# Altium project SAR.PrjPcb
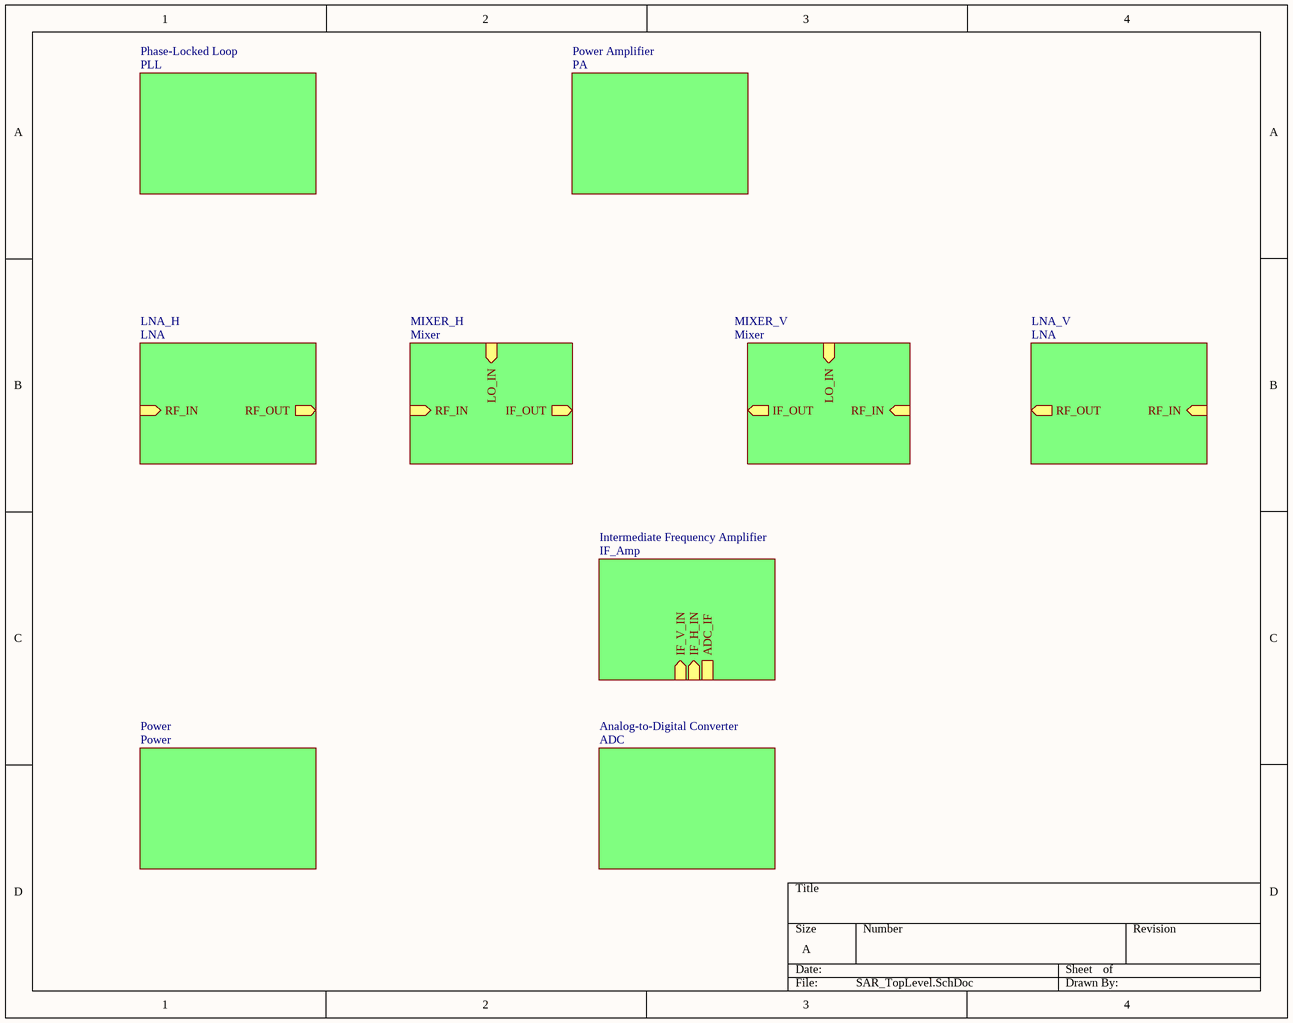
[diagram p0: SAR_TopLevel.SchDoc]
8 sheets, 169 parts. Net scope: hierarchical (ports join the sheet entries above them; power ports are global).
Board file: SAR.PcbDoc
Sheets:
  SAR_TopLevel.SchDoc
    LNA_V = LNA.SchDoc
    MIXER_V = Mixer.SchDoc
    Phase-Locked Loop = PLL.SchDoc
    Intermediate Frequency Amplifier = IF_Amp.SchDoc
    Power = Power.SchDoc
    MIXER_H = Mixer.SchDoc
    LNA_H = LNA.SchDoc
    Analog-to-Digital Converter = ADC.SchDoc
    Power Amplifier = PA.SchDoc

## Sheet SAR_TopLevel.SchDoc
size A; SheetNumber: 1; SheetTotal: 9

### Sub-sheets
Analog-to-Digital Converter = ADC: no entries
Intermediate Frequency Amplifier = IF_Amp: IF_V_IN (in), IF_H_IN (in), ADC_IF (harness ADC_IF)
LNA_H = LNA: RF_IN (in), RF_OUT (out)
LNA_V = LNA: RF_IN (in), RF_OUT (out)
MIXER_H = Mixer: RF_IN (in), IF_OUT (out), LO_IN (in)
MIXER_V = Mixer: LO_IN (in), RF_IN (in), IF_OUT (out)
Phase-Locked Loop = PLL: no entries
Power = Power: no entries
Power Amplifier = PA: no entries

## Sheet LNA.SchDoc
size A; SheetNumber: 4; SheetTotal: 9
Used 2 times, as channels LNA_V, LNA_H. Parts and nets are listed once, with the designators drawn on the sheet.
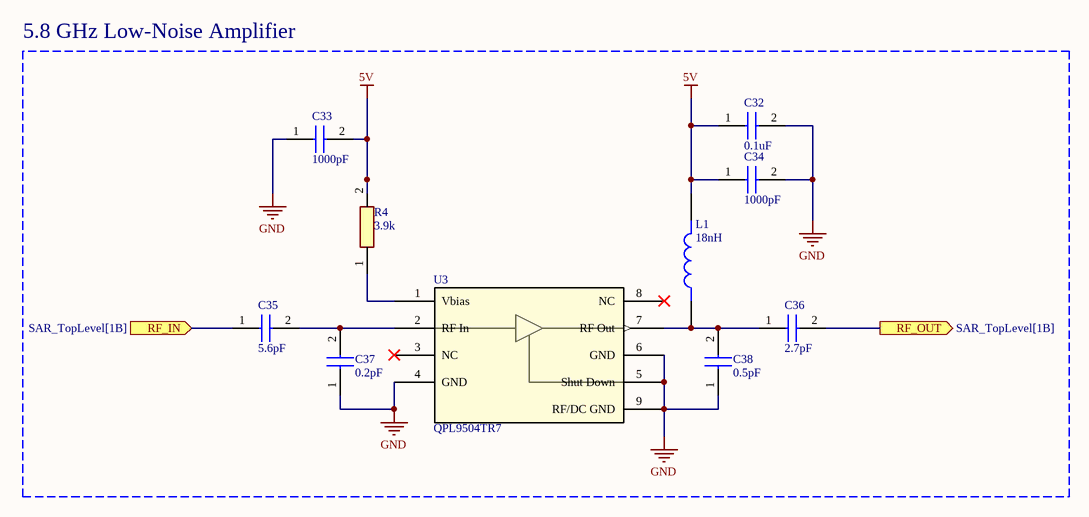
[diagram p1: LNA.SchDoc]

### Parts
C32  0.1uF  [CAPC1005X70N]
C33  1000pF  [CAPC1005X70N]
C34  1000pF  [CAPC1005X70N]
C35  5.6pF  [CAPC1005X55N]
C36  2.7pF  [CAPC1005X55N]
C37  0.2pF  [CAPC1005X55N]
C38  0.5pF  [CAPC1005X55N]
L1  18nH  [IND_0603CS-18NXJRW]
R4  3.9k  [RESC1005X40N]
U3  QPL9504TR7  [SON_504TR7_QOR]

### Blocks framed on the sheet
5.8 GHz Low-Noise Amplifier: C32-C38 L1 R4 U3

### Ports
RF_IN (in, see SAR_TopLevel[1B]), RF_OUT (out, see SAR_TopLevel[1B])

### Nets
5V: C32.1 C33.2 C34.1 L1.2 R4.2
GND: C32.2 C33.1 C34.2 C37.1 C38.1 U3.4(GND) U3.5(Shut_Down) U3.6(GND) U3.9(RF/DC_GND)
RF_IN: C35.1 ; port RF_IN
RF_OUT: C36.2 ; port RF_OUT
NetC35_2: C35.2 C37.2 U3.2(RF_In)
NetC36_1: C36.1 C38.2 L1.1 U3.7(RF_Out)
NetR4_1: R4.1 U3.1(Vbias)

Not connected (* = marked no-connect by the designer): U3 3(NC)* 8(NC)*

### Channels
LNA_V: designators end in _LNA_V; ports RF_IN=NetC35_LNA_V_1 RF_OUT=NetC36_LNA_V_2
LNA_H: designators end in _LNA_H; ports RF_IN=NetC35_LNA_H_1 RF_OUT=NetC36_LNA_H_2

### Library data of the parts
C32 = 0.1uF 0402 Capacitor: GRM155R61A104KA01D; Manufacturer_Name: Murata Electronics; Datasheet Link: https://search.murata.co.jp/Ceramy/image/img/A01X/G101/ENG/GRM155R61A104KA01-02A.pdf; Height: 0.7mm; Manufacturer_Part_Number: GRM155R61A104KA01D; Mouser Part Number: 81-GRM155R61A104KA01; Mouser Price/Stock: https://www.mouser.co.uk/ProductDetail/Murata-Electronics/GRM155R61A104KA01D?qs=5bAuhL3RhmNZw0v59AqOJA%3D%3D; Arrow Part Number: GRM155R61A104KA01D; Arrow Price/Stock: https://www.arrow.com/en/products/grm155r61a104ka01d/murata-manufacturing?utm_currency=USD&region=nac
C33 C34 = 1000pF 0402 Capacitor: GRM155R71H102KA01D; Manufacturer_Name: Murata Electronics; Datasheet Link: https://search.murata.co.jp/Ceramy/image/img/A01X/G101/ENG/GRM155R71H102KA01-01A.pdf; Height: 0.7mm; Manufacturer_Part_Number: GRM155R71H102KA01D; Mouser Part Number: 81-GRM36X102K50; Mouser Price/Stock: https://www.mouser.co.uk/ProductDetail/Murata-Electronics/GRM155R71H102KA01D?qs=%252B5p24MMGZE%2FUF%252ByMyO6GBQ%3D%3D; Arrow Part Number: GRM155R71H102KA01D; Arrow Price/Stock: https://www.arrow.com/en/products/grm155r71h102ka01d/murata-manufacturing?utm_currency=USD&region=nac
C35 = 5.6pF 0402 Capacitor: GJM1555C1H5R6CB01D; Manufacturer_Name: Murata Electronics; Datasheet Link: https://search.murata.co.jp/Ceramy/image/img/A01X/G101/ENG/GJM1555C1H5R6CB01-01A.pdf; Height: 0.55mm; Manufacturer_Part_Number: GJM1555C1H5R6CB01D; Mouser Part Number: 81-GJM1555C1H5R6CB01; Mouser Price/Stock: https://www.mouser.co.uk/ProductDetail/Murata-Electronics/GJM1555C1H5R6CB01D?qs=8NPnst0KC%2FrMobio5LeaaQ%3D%3D; Arrow Part Number: GJM1555C1H5R6CB01D; Arrow Price/Stock: https://www.arrow.com/en/products/gjm1555c1h5r6cb01d/murata-manufacturing?region=nac
C36 = 2.7pF 0402 Capacitor: GJM1555C1H2R7CB01D; Manufacturer_Name: Murata Electronics; Datasheet Link: https://search.murata.co.jp/Ceramy/image/img/A01X/G101/ENG/GJM1555C1H2R7CB01-01A.pdf; Height: 0.55mm; Manufacturer_Part_Number: GJM1555C1H2R7CB01D; Mouser Part Number: 81-GJM1555C1H2R7CB1D; Mouser Price/Stock: https://www.mouser.com/Search/ProductDetail.aspx?qs=%2fCESi%252brw7l%252bwXyZVZJ18SA%3d%3d; Arrow Part Number: GJM1555C1H2R7CB01D; Arrow Price/Stock: https://www.arrow.com/en/products/gjm1555c1h2r7cb01d/murata-manufacturing
C37 = 0.2pF 0402 Capacitor: GJM1555C1HR20BB01D; Manufacturer_Name: Murata Electronics; Datasheet Link: https://search.murata.co.jp/Ceramy/image/img/A01X/G101/ENG/GJM1555C1HR20BB01-01A.pdf; Height: 0.55mm; Manufacturer_Part_Number: GJM1555C1HR20BB01D
C38 = 0.5pF 0402 Capacitor: GJM1555C1HR50BB01D; Manufacturer_Name: Murata Electronics; Datasheet Link: https://search.murata.co.jp/Ceramy/image/img/A01X/G101/ENG/GJM1555C1HR50BB01-01A.pdf; Height: 0.55mm; Manufacturer_Part_Number: GJM1555C1HR50BB01D; Mouser Part Number: 81-GJM1555C1HR50BB01; Mouser Price/Stock: https://www.mouser.com/Search/Refine.aspx?Keyword=81-GJM1555C1HR50BB01; Arrow Part Number: GJM1555C1HR50BB01D; Arrow Price/Stock: https://www.arrow.com/en/products/gjm1555c1hr50bb01d/murata-manufacturing
L1 = 18nH 0603 Inductor: 0603CS-18NXJRW; Package: None; Price: None; Value: *; MP: 0603CS-18NXJRW; Availability: Unavailable
R4 = 3.9k 0402 Resistor: RC0402FR-073K9L; Manufacturer_Name: Yageo Group; Datasheet Link: http://www.yageo.com/documents/recent/PYu-RC0402_51_RoHS_L_6_r.pdf; Height: 0.4mm; Manufacturer_Part_Number: RC0402FR-073K9L; Mouser Part Number: 603-RC0402FR-073K9L; Mouser Price/Stock: https://www.mouser.co.uk/ProductDetail/Yageo/RC0402FR-073K9L?qs=YUgVZYePFqAZ%2F08ApUOsXg%3D%3D; Arrow Part Number: RC0402FR-073K9L; Arrow Price/Stock: https://www.arrow.com/en/products/rc0402fr-073k9l/yageo
U3 = QPL9504TR7: Description; Manufacturer_Name: Qorvo; Copyright: Copyright (C) 2026 Ultra Librarian. All rights reserved.; Manufacturer_Part_Number: QPL9504TR7; RefDes: RefDes; Type: Type

## Sheet Mixer.SchDoc
size B; SheetNumber: 3; SheetTotal: 9
Used 2 times, as channels MIXER_V, MIXER_H. Parts and nets are listed once, with the designators drawn on the sheet.
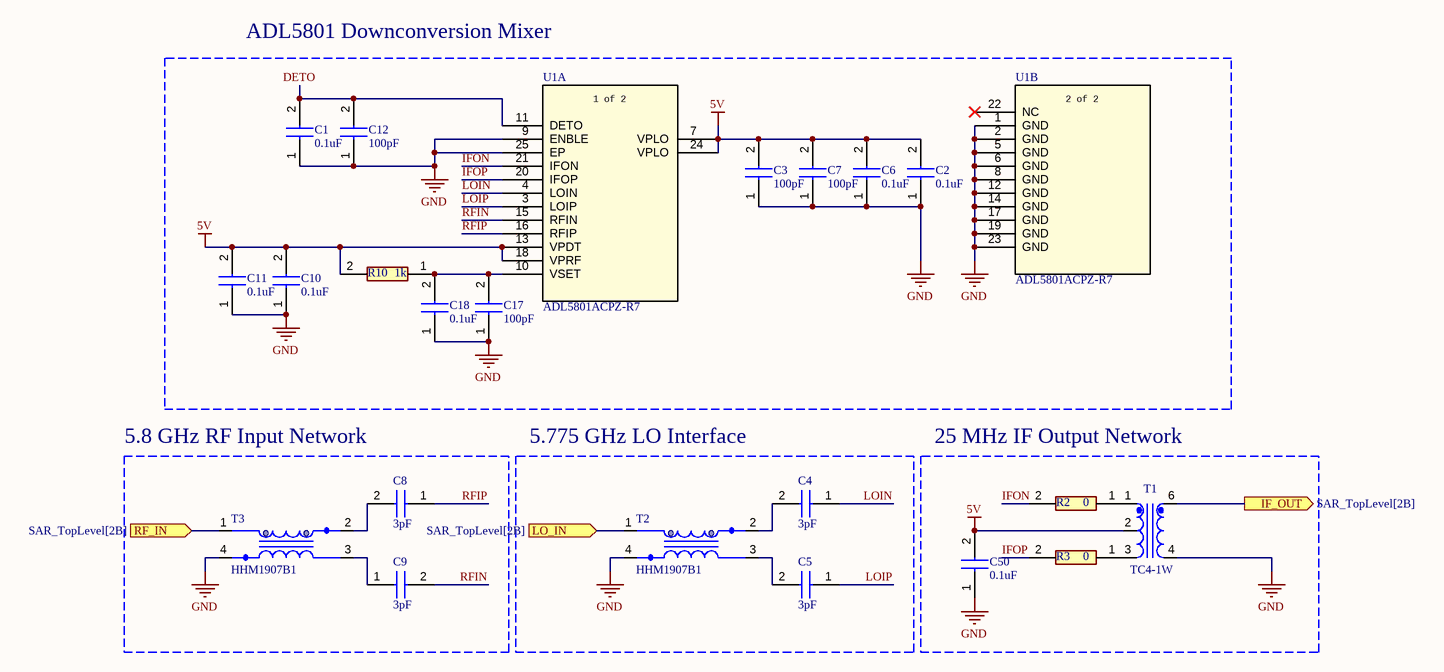
[diagram p2: Mixer.SchDoc]

### Parts
C1  0.1uF  [C0603]
C2  0.1uF  [C0402C104J4RACTU]
C3  100pF  [CAPC1005X70N]
C4  3pF  [CAPC1005X55N]
C5  3pF  [CAPC1005X55N]
C6  0.1uF  [C0402C104J4RACTU]
C7  100pF  [CAPC1005X70N]
C8  3pF  [CAPC1005X55N]
C9  3pF  [CAPC1005X55N]
C10  0.1uF  [C0402C104J4RACTU]
C11  0.1uF  [C0402C104J4RACTU]
C12  100pF  [CAPC1005X70N]
C17  100pF  [CAPC1005X70N]
C18  0.1uF  [C0603]
C50  0.1uF  [C0402C104J4RACTU]
R2  0  [RESC1005X40N]
R3  0  [RESC1005X40N]
R10  1k  [RESC1005X40N]
T1  TC4-1W  [AT224_MNC]
T2  HHM1907B1  [HHM1907B1]
T3  HHM1907B1  [HHM1907B1]
U1  ADL5801ACPZ-R7  [CP_24_3_ADI]  (parts A,B of 2)

### Blocks framed on the sheet
ADL5801 Downconversion Mixer: C1-C3 C6 C7 C10-C12 C17 C18 R10 U1
5.8 GHz RF Input Network: C8 C9 T3
5.775 GHz LO Interface: C4 C5 T2
25 MHz IF Output Network: C50 R2 R3 T1

### Ports
IF_OUT (out, see SAR_TopLevel[2B]), LO_IN (in, see SAR_TopLevel[2B]), RF_IN (in, see SAR_TopLevel[2B])

### Nets
5V: C2.2 C3.2 C6.2 C7.2 C10.2 C11.2 C50.2 R10.2 T1.2(PRICT) U1.7(VPLO) U1.13(VPDT) U1.18(VPRF) U1.24(VPLO)
GND: C1.1 C2.1 C3.1 C6.1 C7.1 C10.1 C11.1 C12.1 C17.1 C18.1 C50.1 T1.4(SEC) T2.4(GND) T3.4(GND) U1.1(GND) U1.2(GND) U1.5(GND) U1.6(GND) U1.8(GND) U1.9(ENBLE) U1.12(GND) U1.14(GND) U1.17(GND) U1.19(GND) U1.23(GND) U1.25(EP)
DETO: C1.2 C12.2 U1.11(DETO)
IF_OUT: T1.6(SECDOT) ; port IF_OUT
IFON: R2.2 U1.21(IFON)
IFOP: R3.2 U1.20(IFOP)
LO_IN: T2.1(UNBAL) ; port LO_IN
LOIN: C4.1 U1.4(LOIN)
LOIP: C5.1 U1.3(LOIP)
RF_IN: T3.1(UNBAL) ; port RF_IN
RFIN: C9.2 U1.15(RFIN)
RFIP: C8.1 U1.16(RFIP)
NetC4_2: C4.2 T2.2(BALANCED_1)
NetC5_2: C5.2 T2.3(BALANCED_2)
NetC8_2: C8.2 T3.2(BALANCED_1)
NetC9_1: C9.1 T3.3(BALANCED_2)
NetC17_2: C17.2 C18.2 R10.1 U1.10(VSET)
NetR2_1: R2.1 T1.1(PRIDOT)
NetR3_1: R3.1 T1.3(PRI)

Not connected (* = marked no-connect by the designer): U1 22(NC)*

### Channels
MIXER_V: designators end in _MIXER_V; ports IF_OUT=NetT1_MIXER_V_6 LO_IN=NetT2_MIXER_V_1 RF_IN=NetT3_MIXER_V_1
MIXER_H: designators end in _MIXER_H; ports IF_OUT=NetT1_MIXER_H_6 LO_IN=NetT2_MIXER_H_1 RF_IN=NetT3_MIXER_H_1

### Notes on the sheet
- DWG. NO.
- REV.
- SHT.
- THIS DOCUMENT AND THE DATA DISCLOSED HEREIN OR HEREWITH IS THE PROPERTY OF ALTIUM LIMITED AND MAY BE FREELY DISTRIBUTED IN WHOLE. NO RIGHTS ARE RESERVED OR EXPRESS OR IMPLIED WARANTEE GIVEN.
- REVISION
- DESCRIPTION
- DATE
- APPROVED
- ENG:
- APPROVALS
- PROJECT
- DSN:
- CHK:
- REFERENCE DOCUMENTS
- PROJECT REVISION:
- TITLE
- DOCUMENT REVISION:
- DESIGN ITEM:
- BOM:
- FAB DWG:
- PCB DWG:
- ASSY DWG:
- SCALE:
- SIZE
- B
- CAGE CODE
- FILE NAME
- DWG NO.
- SHEET
- OF
- REV
- (in symbol ADL5801ACPZ-R7, part A) 1 of 2
- (in symbol ADL5801ACPZ-R7, part B) 2 of 2

### Library data of the parts
C1 C18 = 0.1uF 0603 Capacitor: C0603C104K4RACAUTO; Manufacturer_Name: Yageo Group; Datasheet Link: https://content.kemet.com/datasheets/KEM_C1023_X7R_AUTO_SMD.pdf; Height: 0.87mm; Manufacturer_Part_Number: C0603C104K4RACAUTO; Mouser Part Number: 80-C0603C104K4RAUTO; Mouser Price/Stock: https://www.mouser.co.uk/ProductDetail/KEMET/C0603C104K4RACAUTO?qs=OHu5RF0w3Qq6uXbO9XN%2FyA%3D%3D; Arrow Part Number: C0603C104K4RACAUTO; Arrow Price/Stock: https://www.arrow.com/en/products/c0603c104k4racauto/kemet-corporation?region=nac
C2 C6 C10 C11 = 0.1uF Capacitor 0402: C0402C104K4RACTU; Manufacturer_Name: Yageo Group; Datasheet Link: https://content.kemet.com/datasheets/KEM_C1002_X7R_SMD.pdf; Height: 0.55mm; Manufacturer_Part_Number: C0402C104K4RACTU; Mouser Part Number: 80-C0402C104K4R; Mouser Price/Stock: https://www.mouser.co.uk/ProductDetail/KEMET/C0402C104K4RACTU?qs=DBJr%252BvBUjU54jK7d4uAeew%3D%3D; Arrow Part Number: C0402C104K4RACTU; Arrow Price/Stock: https://www.arrow.com/en/products/c0402c104k4ractu/kemet-corporation.html?utm_currency=USD&region=nac
C3 C7 C12 C17 = 100pF Capacitor 0402: GRM1555C1H101JA01J; Manufacturer_Name: Murata Electronics; Datasheet Link: https://search.murata.co.jp/Ceramy/image/img/A01X/G101/ENG/GRM1555C1H101JA01-01A.pdf; Height: 0.7mm; Manufacturer_Part_Number: GRM1555C1H101JA01J; Mouser Part Number: 81-GRM1555C1H101JA1J; Mouser Price/Stock: https://www.mouser.co.uk/ProductDetail/Murata-Electronics/GRM1555C1H101JA01J?qs=ouTquLLW2S6yVyqkMCWoRg%3D%3D; Arrow Part Number: GRM1555C1H101JA01J; Arrow Price/Stock: https://www.arrow.com/en/products/grm1555c1h101ja01j/murata-manufacturing?utm_currency=USD&region=nac
C4 C5 C8 C9 = 3pF 0402 Capacitor: GJM1555C1H3R0BB01D; Manufacturer_Name: Murata Electronics; Datasheet Link: https://search.murata.co.jp/Ceramy/image/img/A01X/G101/ENG/GJM1555C1H3R0BB01-01A.pdf; Height: 0.55mm; Manufacturer_Part_Number: GJM1555C1H3R0BB01D; Mouser Part Number: 81-GJM1555C1H3R0BB01; Mouser Price/Stock: https://www.mouser.co.uk/ProductDetail/Murata-Electronics/GJM1555C1H3R0BB01D?qs=fOe5G3t%252BQHoZjxUrLCJNQQ%3D%3D; Arrow Part Number: GJM1555C1H3R0BB01D; Arrow Price/Stock: https://www.arrow.com/en/products/gjm1555c1h3r0bb01d/murata-manufacturing
C50 = 0.1uF 0402 Capacitor: C0402C104K4RACTU; Manufacturer_Name: Yageo Group; Datasheet Link: https://content.kemet.com/datasheets/KEM_C1002_X7R_SMD.pdf; Height: 0.55mm; Manufacturer_Part_Number: C0402C104K4RACTU; Mouser Part Number: 80-C0402C104K4R; Mouser Price/Stock: https://www.mouser.co.uk/ProductDetail/KEMET/C0402C104K4RACTU?qs=DBJr%252BvBUjU54jK7d4uAeew%3D%3D; Arrow Part Number: C0402C104K4RACTU; Arrow Price/Stock: https://www.arrow.com/en/products/c0402c104k4ractu/kemet-corporation.html?utm_currency=USD&region=nac
R2 R3 = 0 Ohm 0402 Resistor: RC0402JR-070RL; Manufacturer_Name: Yageo Group; Datasheet Link: https://www.yageo.com/upload/media/product/products/datasheet/rchip/PYu-RC_Group_51_RoHS_L_12.pdf; Height: 0.4mm; Manufacturer_Part_Number: RC0402JR-070RL; Mouser Part Number: 603-RC0402JR-070RL; Mouser Price/Stock: https://www.mouser.co.uk/ProductDetail/YAGEO/RC0402JR-070RL?qs=5Bml4Cp94iv7ykKkzPrwpQ%3D%3D; Arrow Part Number: RC0402JR-070RL; Arrow Price/Stock: https://www.arrow.com/en/products/rc0402jr-070rl/yageo.html?utm_currency=USD&region=asia
R10 = 1k 0402 Resistor: RC0402FR-071KL; Manufacturer_Name: Yageo Group; Datasheet Link: https://yageogroup.com/products/Resistors/part/RC0402FR-071KL; Height: 0.4mm; Manufacturer_Part_Number: RC0402FR-071KL; Mouser Part Number: 603-RC0402FR-071KL; Mouser Price/Stock: https://www.mouser.co.uk/ProductDetail/YAGEO/RC0402FR-071KL?qs=V1yeUXFNrknDEmWLmm5v6g%3D%3D; Arrow Part Number: RC0402FR-071KL; Arrow Price/Stock: https://www.arrow.com/en/products/rc0402fr-071kl/yageo.html?utm_currency=USD&region=asia
T1 = TC4-1W+ 1:4 Transformer: TC4-1W+; Manufacturer_Name: Mini Circuits; Copyright: Copyright (C) 2026 Ultra Librarian. All rights reserved.; Manufacturer_Part_Number: TC4-1W; RefDes: RefDes; Type: Type
T2 T3 = 5.8 GHz Balun Transformer: MANF: Mini-Circuit; PARAM: 10~6000MHz; DESC: DESCRIPTION; MANF_P#: TCM1-63AX+; PARAM2: 0.2W, 30mA, -40~85oC; ASSEMBLY: ASSEMBLY; PRICE: PRICE; VALUE: HHM1907B1
U1 = ADL5801ACPZ-R7: High IP3, 10 MHz TO 6 GHz, Active Mixer; Manufacturer_Name: Analog Devices Inc; Copyright: Copyright (C) 2026 Ultra Librarian. All rights reserved.; Manufacturer_Part_Number: ADL5801ACPZ-R7; Datasheet: https://www.analog.com/media/en/technical-documentation/data-sheets/ADL5801.pdf; RefDes: RefDes; Type: Type

## Sheet PLL.SchDoc
size B; SheetNumber: 6; SheetTotal: 8
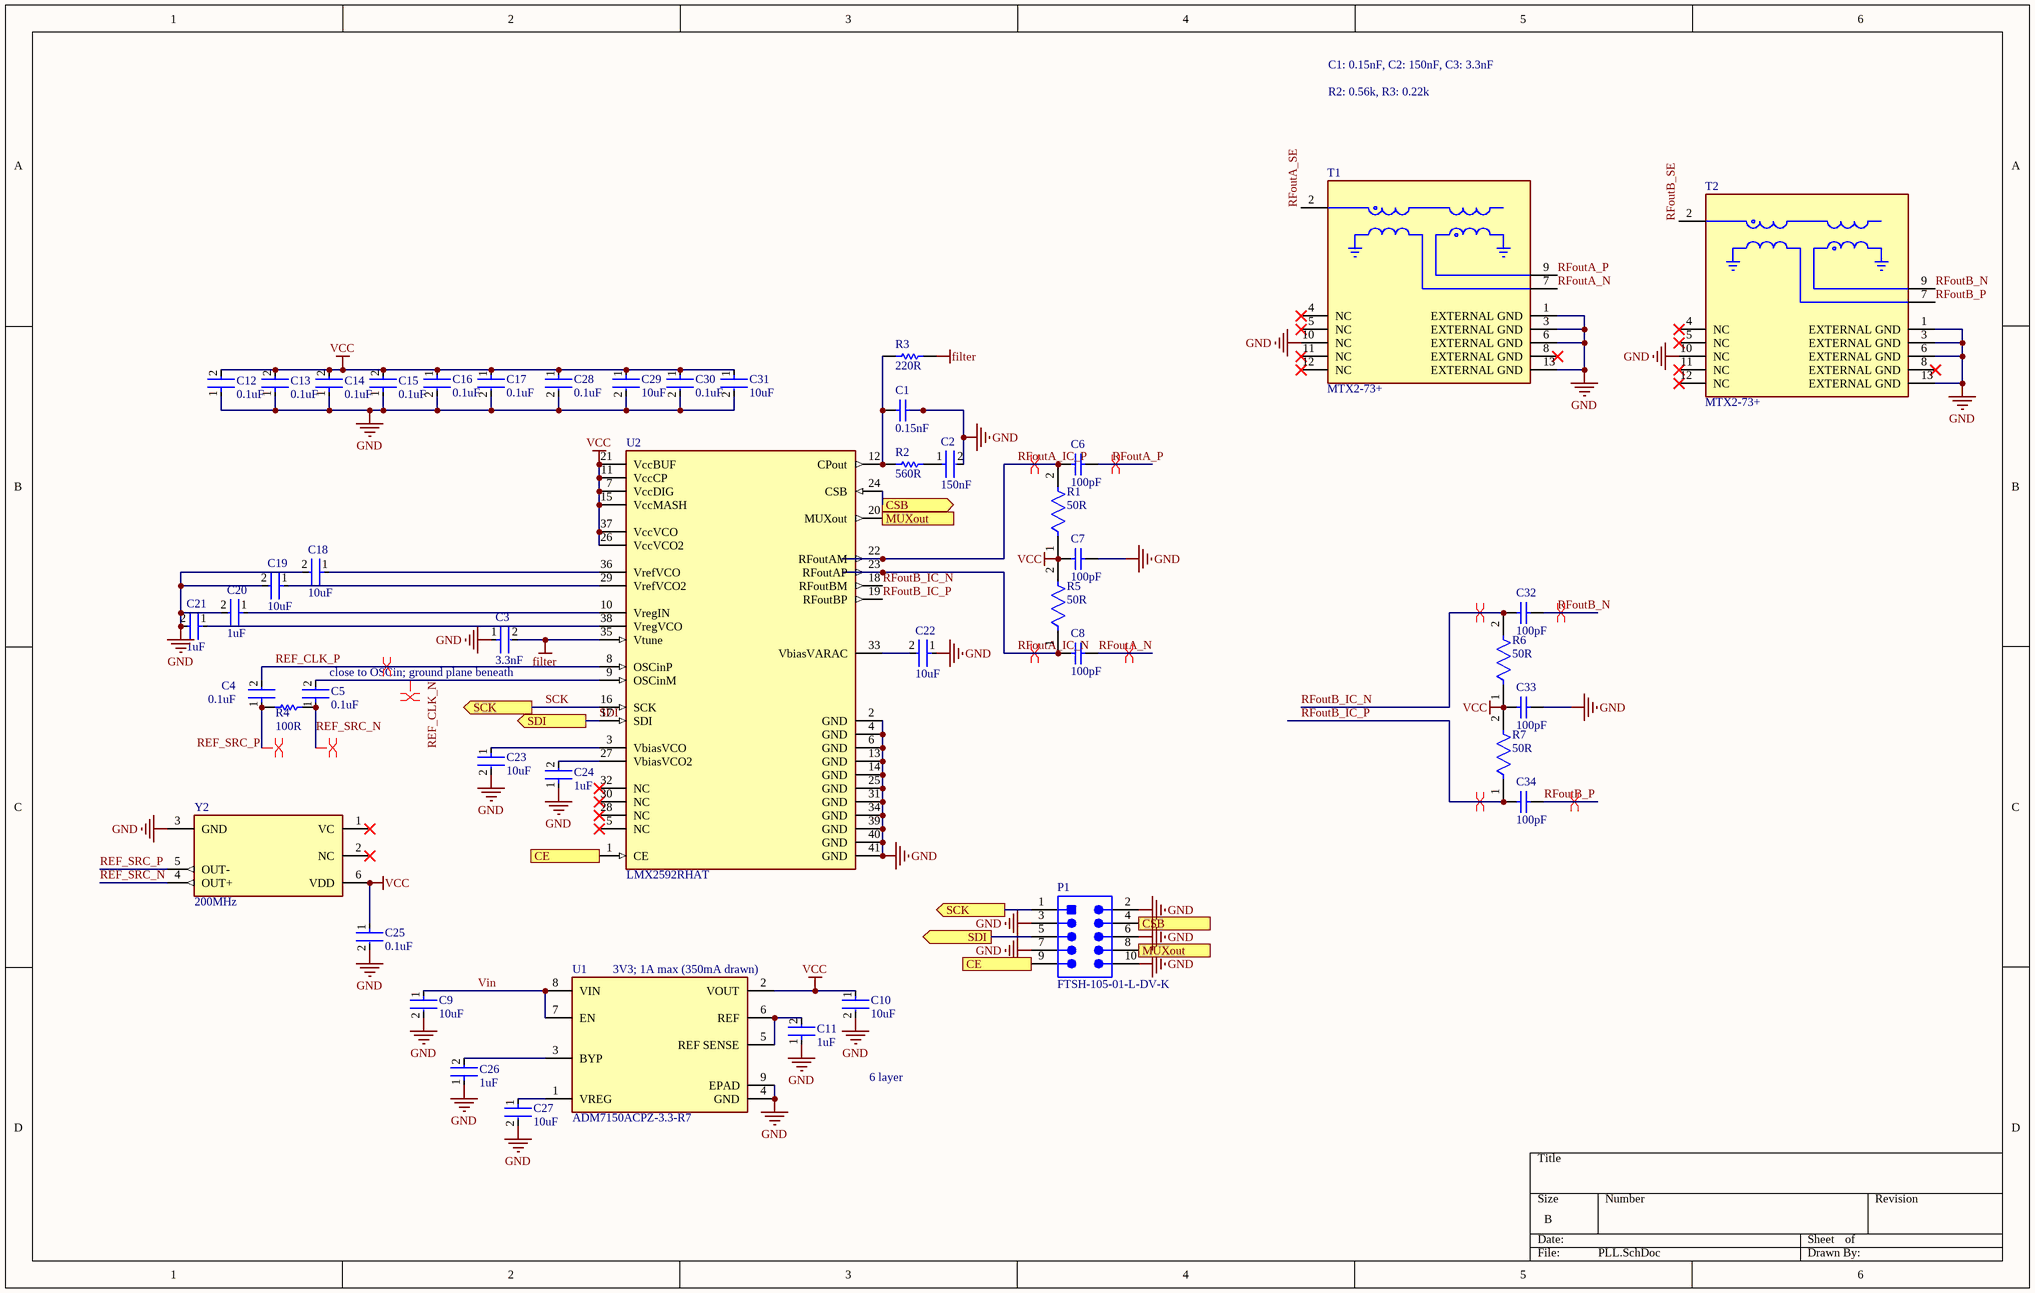
[diagram p3: PLL.SchDoc]

### Parts
(Parts that share a designator on the sheet are numbered #1, #2 ... from top to bottom, then left to right.)
C1#1  0.15nF  [CAPC1608X90X35LL15T15]
C2#1  150nF  [FP-GRM31C-0_2-e0_3_0_8-IPC_A]
C3#1  3.3nF  [FP-GCM188-0_1-MFG]
C4#1  0.1uF  [FP-C0603C-CF-MFG]
C5#1  0.1uF  [FP-C0603C-CF-MFG]
C6#1  100pF  [CAPC1608X90X35NL10T15]
C7#1  100pF  [CAPC1608X90X35NL10T15]
C8  100pF  [CAPC1608X90X35NL10T15]
C9  10uF  [FP-GRM188-0_15-MFG]
C10  10uF  [FP-GRM188-0_15-MFG]
C11  1uF  [FP-0603-L_1_6_0_15-W_0_8-IPC_C]
C12  0.1uF  [FP-C0603C-CF-MFG]
C13  0.1uF  [FP-C0603C-CF-MFG]
C14  0.1uF  [FP-C0603C-CF-MFG]
C15  0.1uF  [FP-C0603C-CF-MFG]
C16  0.1uF  [FP-C0603C-CF-MFG]
C17  0.1uF  [FP-C0603C-CF-MFG]
C18  10uF  [FP-GRM188-0_15-MFG]
C19  10uF  [FP-GRM188-0_15-MFG]
C20  1uF  [FP-0603-L_1_6_0_15-W_0_8-IPC_C]
C21  1uF  [FP-0603-L_1_6_0_15-W_0_8-IPC_C]
C22  10uF  [FP-GRM188-0_15-MFG]
C23  10uF  [FP-GRM188-0_15-MFG]
C24  1uF  [FP-0603-L_1_6_0_15-W_0_8-IPC_C]
C25  0.1uF  [FP-C0603C-CF-MFG]
C26  1uF  [FP-0603-L_1_6_0_15-W_0_8-IPC_C]
C27  10uF  [FP-GRM188-0_15-MFG]
C28  0.1uF  [FP-C0603C-CF-MFG]
C29  10uF  [FP-GRM188-0_15-MFG]
C30  0.1uF  [FP-C0603C-CF-MFG]
C31  10uF  [FP-GRM188-0_15-MFG]
C32  100pF  [CAPC1608X90X35NL10T15]
C33  100pF  [CAPC1608X90X35NL10T15]
C34  100pF  [CAPC1608X90X35NL10T15]
P1  FTSH-105-01-L-DV-K  [SMTC-FTSH-105-01-L-DV-K_V]
R1  50R  [FP-CRCW0603-e3-MFG]
R2  560R  [RESC1608X55X25ML10T15]
R3  220R  [RESC1608X55X25ML10T15]
R4  100R  [RESC1609X50X30ML8T20]
R5  50R  [FP-CRCW0603-e3-MFG]
R6  50R  [FP-CRCW0603-e3-MFG]
R7  50R  [FP-CRCW0603-e3-MFG]
T1  MTX2-73+  [FP-MTX2-73+-MFG]
T2  MTX2-73+  [FP-MTX2-73+-MFG]
U1  ADM7150ACPZ-3.3-R7  [FP-CP-8-11-IPC_C]
U2  LMX2592RHAT  [FP-RHA0040H-IPC_B]
Y2  200MHz  [FP-SiT5021AI-MFG]

### Ports
CE (out), CSB (out), MUXout (out), SCK (out), SDI (out)

### Nets
filter: C3#1.2 R3.2 U2.35(Vtune)
GND: C1#1.2 C2#1.2 C3#1.1 C7#1.2 C9.2 C10.2 C11.1 C12.1 C13.1 C14.1 C15.1 C16.2 C17.2 C18.2 C19.2 C20.2 C21.2 C22.1 C23.2 C24.1 C25.2 C26.1 C27.2 C28.2 C29.2 C30.2 C31.2 C33.2 P1.2 P1.3 P1.6 P1.7 P1.10 T1.1(EXTERNAL_GND) T1.3(EXTERNAL_GND) T1.6(EXTERNAL_GND) T1.10(NC) T1.13(EXTERNAL_GND) T2.1(EXTERNAL_GND) T2.3(EXTERNAL_GND) T2.6(EXTERNAL_GND) T2.10(NC) T2.13(EXTERNAL_GND) U1.4(GND) U1.9(EPAD) U2.2(GND) U2.4(GND) U2.6(GND) U2.13(GND) U2.14(GND) U2.25(GND) U2.31(GND) U2.34(GND) U2.39(GND) U2.40(GND) U2.41(GND) Y2.3(GND)
VCC: C7#1.1 C10.1 C12.2 C13.2 C14.2 C15.2 C16.1 C17.1 C25.1 C28.1 C29.1 C30.1 C31.1 C33.1 R1.1 R5.2 R6.1 R7.2 U1.2(VOUT) U2.7(VccDIG) U2.11(VccCP) U2.15(VccMASH) U2.21(VccBUF) U2.26(VccVCO2) U2.37(VccVCO) Y2.6(VDD)
REF_CLK_N: C5#1.2 U2.9(OSCinM)
REF_CLK_P: C4#1.2 U2.8(OSCinP)
REF_SRC_N: C5#1.1 R4.2 Y2.4(OUT+)
REF_SRC_P: C4#1.1 R4.1 Y2.5(OUT-)
RFoutA_IC_N: C8.1 R5.1 U2.23(RFoutAP)
RFoutA_IC_P: C6#1.1 R1.2 U2.22(RFoutAM)
RFoutA_N: C8.2 T1.7(SECONDARY(Balanced))
RFoutA_P: C6#1.2 T1.9(SECONDARY_DOT(Balanced))
RFoutA_SE: T1.2(PRIMARY_DOT(Unbalanced))
RFoutB_IC_N: C32.1 R6.2 U2.18(RFoutBM)
RFoutB_IC_P: C34.1 R7.1 U2.19(RFoutBP)
RFoutB_N: C32.2 T2.9(SECONDARY_DOT(Balanced))
RFoutB_P: C34.2 T2.7(SECONDARY(Balanced))
RFoutB_SE: T2.2(PRIMARY_DOT(Unbalanced))
SCK: P1.1 U2.16(SCK) ; port SCK
SDI: P1.5 U2.17(SDI) ; port SDI
Vin: C9.1 U1.7(EN) U1.8(VIN)
NetC1#1_1: C1#1.1 R2.1 R3.1 U2.12(CPout)
NetC2#1_1: C2#1.1 R2.2
NetC11_2: C11.2 U1.5(REF_SENSE) U1.6(REF)
NetC18_1: C18.1 U2.36(VrefVCO)
NetC19_1: C19.1 U2.29(VrefVCO2)
NetC20_1: C20.1 U2.10(VregIN)
NetC21_1: C21.1 U2.38(VregVCO)
NetC22_2: C22.2 U2.33(VbiasVARAC)
NetC23_1: C23.1 U2.3(VbiasVCO)
NetC24_2: C24.2 U2.27(VbiasVCO2)
NetC26_2: C26.2 U1.3(BYP)
NetC27_1: C27.1 U1.1(VREG)
NetP1_4: P1.4 U2.24(CSB) ; port CSB
NetP1_8: P1.8 U2.20(MUXout) ; port MUXout
NetP1_9: P1.9 U2.1(CE) ; port CE

Not connected (* = marked no-connect by the designer): T1 4(NC)* 5(NC)* 8(EXTERNAL_GND)* 11(NC)* 12(NC)*; T2 4(NC)* 5(NC)* 8(EXTERNAL_GND)* 11(NC)* 12(NC)*; U2 5(NC)* 28(NC)* 30(NC)* 32(NC)*; Y2 1(VC)* 2(NC)*

### Layout directives
differential pair: REF_CLK_N, REF_CLK_P, REF_SRC_N, REF_SRC_P, RFoutA_IC_N, RFoutA_IC_P, RFoutA_N, RFoutA_P, RFoutB_IC_N, RFoutB_IC_P, RFoutB_N, RFoutB_P

### Notes on the sheet
- C1: 0.15nF, C2: 150nF, C3: 3.3nF
- R2: 0.56k, R3: 0.22k
- close to OSCin; ground plane beneath
- (near U1) 3V3; 1A max (350mA drawn)
- 6 layer

### Library data of the parts
C1#1 = CMP-2006-02248-1: Manufacturer: Kemet; Part Number: C0603C151J5GAC7867
C2#1 = CMP-06035-013092-1: Chip Multilayer Ceramic Capacitors for General Purpose, 1206, 0.15uF, C0G, 30ppm/°C, 5%, 50V
C3#1 = CMP-06035-044585-1: Ceramic Capacitor for Automotive 3.3nF  ±1% 50VDC C0G 0603 Paper T/R
C4#1 C5#1 C12-C17 C25 C28 C30 = CMP-2006-03061-2: CAP CER 0.1UF 50V X7R 0603; Manufacturer: KEMET; Manufacturer Part Number: C0603C104K5RACTU; Tolerance: 0.1; Temperature Coefficient: 30ppm/°C; Material: Ceramic; Automotive Grade: Grade 1; Value: 0.10 μF; Temperature: -55°C to +125°C; RoHS: TRUE; Temperature Range High: +125°C; Lead Free: Yes; Octopart: https://octopart.com/c0603c104k5ractu-kemet-139244; Digikey Description: CAP CER 0.1UF 50V X7R 0603; Category: Cap; Package: C0603C-CF; ComponentLink2Description: Datasheet; Temperature Range Low: -55°C; Device Class L1: Passive Components; Voltage Rating: 50 V; Automotive: Yes; Device Class L3: Ceramic Capacitors; ComponentLink2URL: https://api.kemet.com/component-edge/download/datasheet/C0603C100J5GACAUTO.pdf; Capacitance: 0.10 μF; Device Class L2: Capacitors; Temperature Characteristic: X7R; Height: 0.87mm
C6#1 C7#1 C8 C32-C34 = CMP-2006-02595-1: Part Number: GRM1885C1H101JA01D; Manufacturer: Murata
C9 C10 C18 C19 C22 C23 C27 C29 C31 = CMP-06035-003612-1: Chip Multilayer Ceramic Capacitors for General Purpose, 0603, 10uF, X5R, 15%, 20%, 10V; Tolerance: 20%; Dielectric: X5R; Package Quantity: 4000; Width: 0.8mm; Case/Package: 0603; Thickness: 0.035inch; Capacitance: 10uF; Voltage Rating: 10V; Voltage Rating (DC): 10V; Termination: SMD/SMT; Length: 1.6mm; Lead Free: Lead Free; Mount: Surface Mount; Height: 0.8mm; Depth: 0.8mm; Packaging: Tape and Reel; Weight: 0.000222oz; Min Operating Temperature: -55°C; Case Code (Metric): 1608; Max Operating Temperature: 85°C; Case Code (Imperial): 0603; Material: Ceramic
C11 C20 C21 C24 C26 = CMP-2000-07531-4: Ceramic Capacitor General Use 1uF ±10% 50V X7R 0603; Series: M; Width: 0.031inch; Mount: Surface Mount; Radiation Hardening: No; Voltage Rating (DC): 50V; Packaging: Tape and Reel; Termination: SMD/SMT; Depth: 0.8mm; Case Code (Metric): 1608; Case Code (Imperial): 0603; Height: 0.8mm; Voltage Rating: 50V; Package Quantity: 1; Halogen Free: Halogen Free; Dielectric: X7R; Min Operating Temperature: -55°C; Length: 1.6mm; Construction: Flat; Tolerance: 10%; Thickness: 0.037inch; Max Operating Temperature: 125°C; Case/Package: 0603; Capacitance: 1uF; RoHS Compliant: Yes
P1 = CMP-2000-05353-1: Male Header, Pitch 1.27 mm, 2 x 5 Position, Height 6.25 mm; Manufacturer: Samtec; Pitch: 0.050"(1.27mm); Other Names: Q3937619; Number of Positions: 10; Mating Products: SFMC-105-L2-S-D-TR-ND / -CONN.05"SURFACE10POSSMT / FLE-105-01-G-DV-TR-ND / -CONNSKT1.27MM10POSDUALSMD / FLE-105-01-G-DV-A-P-ND / -CONNSKT1.27MM10POSDUALSMD / FLE-105-01-G-DV-A-ND / -CONNSKT1.27MM10POSDUALSMD / CLP-105-02-G-D-P-TR-ND / -CONNRCPT10POSDUAL.05"SMD / SAM1155-05-ND / -CONNRCPT10POSDUAL.05"SMD / SAM1154-05-ND / -CONNRCPT10POSDUAL.05"SMD / SAM1153-05-ND / -CONNRCPT10POSDUAL.05"SMD / SAM1226-05-ND / -CONNRCPT.05"10POSDUALSMD; Number of Positions Loaded: All; Connector Type: Header,Unshrouded; Product Training Modules: Board-to-BoardConnectors; Datasheet Version: Rev. ET, 10/1995; Number of Rows: 2; Standard Package: 1; Package Description: Male Header, Pitch 1.27 mm, 2 x 5 Position, Height 5.97 mm, Tail Length 4.32 mm; Contact Finish Thickness: 10µin(0.25µm); Series: FTSH; Termination: Solder; Contact Type: MalePin; Color: Black; Package Reference: FTSH-105-01-L-DV-K; Family: RectangularConnectors-Headers,MalePins; Package URL: http://suddendocs.samtec.com/prints/ftsh-1xx-xx-xxx-dv-xxx-footprint.pdf; Packaging: Tube; Mounting Type: SurfaceMount; Category: Connectors,Interconnects; Datasheet URL: http://suddendocs.samtec.com/prints/ftsh-1xx-xx-xxx-dv-xxx-mkt.pdf; Row Spacing: 0.050"(1.27mm); Manufacturer URL: http://www.samtec.com/; Contact Mating Length: 0.120"(3.05mm); Contact Finish: Gold
R1 R5-R7 = CMP-2000-03436-2: RES Thick Film, 50Ω, 1%, 0.1W, 100ppm/°C, 0603; Voltage Rating (DC): 75V; Power Rating: 100mW; Case/Package: 0603; Packaging: Tape and Reel; Military Standard: Not; REACH SVHC: No SVHC; Width: 0.85mm; Max Operating Temperature: 155°C; Case Code (Metric): 1608; Temperature Coefficient: 100ppm/°C; Lead Free: Lead Free; Height: 0.45mm; Composition: Thick Film; Termination: SMD/SMT; Contact Plating: Tin; Number of Pins: 2; Tolerance: 1%; Resistance: 50R; Depth: 0.85mm; Weight: 7.1E-05oz; Min Operating Temperature: -55°C; Length: 1.55mm; Radiation Hardening: No; Voltage Rating: 75V; Case Code (Imperial): 0603; Package Quantity: 5000; Mount: Surface Mount
R2 = CMP-1659-00038-1: Chip Resistor, 560 Ohm, +/- 1%, 0.1 W, -55 to 155 degC, 0603 (1608 Metric), RoHS, Tape and Reel; Resistance: 820 Ohm; Case\Package: 0603; Power Rating: 100 mW; Voltage Rating (DC): 50 V; Height: 0.45 mm; Case Code (Metric): 1608; Max Operating Temperature: 155 degC; PackageDescription: 2-Pin Surface Mount Device, Body 1.6 x 0.8 mm; PackageReference: 0603; ComponentLink2Description: Datasheet; ComponentLink1Description: Manufacturer URL; Case Code (Imperial): 0603; Packaging: Tape and Reel; DatasheetVersion: Rev. 4, 02/2016; ComponentLink2URL: http://www.yageo.com/documents/recent/PYu-RC_Group_51_RoHS_L_04.pdf; Length: 1.6 mm; Mount: Surface Mount; Min Operating Temperature: -55 degC; Pins: 2; RoHSCompliant: true; Voltage Rating: 50 V; REACH SVHC: No SVHC; Tolerance: 1%; ComponentLink1URL: http://www.yageo.com/; Width: 0.8 mm
R3 = CMP-1659-00018-2: General Purpose Chip Resistors, 220 Ohm, +/- 1%, -55 to 155 degC, 0603 (1608 Metric), RoHS, Tape and Reel; RoHSCompliant: false; DatasheetVersion: Rev. 4, 04/2009; ComponentLink2Description: Datasheet; ComponentLink2URL: https://datasheet.ciiva.com/11808/0900766b80f96399-11808136.pdf; ComponentLink1URL: http://www.yageo.com/; ComponentLink1Description: Manufacturer URL; PackageReference: 0603; PackageDescription: 2-Pin Surface Mount Device, Body 1.6 x 0.8 mm
R4 = CMP-2000-03824-5: Chip Resistor, 100 Ohm, +/- 1%, 100 mW,-55 to 155 degC, 0603 (1608 Metric), RoHS, Tape and Ree; Manufacturer: Vishay Semiconductor; ComponentLink2URL: http://www.vishay.com/docs/20035/dcrcwe3.pdf; ComponentLink1URL: http://www.vishay.com/; Mounting Technology: Surface Mount; ComponentLink1Description: Manufacturer URL; ComponentLink2Description: Datasheet; PackageDescription: 2-Pin Surface Mount Device, Body 1.575 x 0.85 mm; PackageReference: 0603; DatasheetVersion: 06/2012
T1 T2 = CMP-199822-000008-1: 1:2 MMIC Transformer, 2000 - 7000 MHz, 50Ω; Manufacturer: Mini-Circuits; Return Loss: 6.39dB; Insertion Loss: 1.55-3.37dB; Ipc Land Pattern Name: QFN51P300X300X89-12; Height: 0.039inch; ComponentLink2Description: Datasheet; Package: 0; Automotive: No; Temperature: -40°C to +85°C; Manufacturer Part Number: MTX2-73+; Footprint Url: https://ww2.minicircuits.com/case_style/DQ1225.pdf; Device Class L2: Transformers; Category: Trans; Frequency: 2000-7000MHz; RoHS: TRUE; Device Class L3: unset; ComponentLink2URL: https://www.minicircuits.com/pdfs/MTX2-73+.pdf; Turns Ratio: 1:2; Device Class L1: Passive Components; Lead Free: Yes; Octopart: https://octopart.com/mtx2-73%2B-mini-circuits-107467473; Temperature Range High: +85°C; Temperature Range Low: -40°C
U1 = CMP-09138-000026-1: IC REG LINEAR 3.3V 800MA 8LFCSP; Polarity: Positive; Quiescent Current: 7mA; Output Type: Fixed; Max Input Voltage: 16V; Number of Regulators: 1; Min Current Limit: 1A; Min Input Voltage: 4.5V; Accuracy: 1%; Operating Supply Current: 8.6mA; Power Supply Rejection Ratio (PSRR): -86dB; Packaging: Tape and Reel; RoHS Compliant: Yes; Output Current: 800mA; Output Voltage: 3.3V; Max Operating Temperature: 125°C; Mount: Surface Mount; Number of Outputs: 1; Lead Free: Contains Lead; Contact Plating: Tin; Max Output Current: 800mA; Min Operating Temperature: -40°C; Number of Pins: 8
U2 = CMP-04856-000019-1: IC PLL FREQ SYNTH W/VCO 40VQFN; Input: CMOS; Max Supply Voltage: 3.45V; Operating Supply Voltage: 3.3V; Number of Circuits: 1; Min Supply Voltage: 3.15V; Max Frequency: 9.8GHz; PLL: Yes; Case/Package: VQFN; Max Operating Temperature: 85°C; Mount: Surface Mount; Min Operating Temperature: -40°C; Number of Pins: 40; RoHS Compliant: Yes; REACH SVHC: No SVHC; Packaging: Cut Tape; Frequency: 9.8GHz; Lead Free: Lead Free
Y2 = CMP-25159-261274-1: MEMS OSC VCTCXO 200.0000MHZ LVDS; Frequency Stability: 5ppm; Max Supply Current: 55mA; Case/Package: SMD/SMT; Packaging: Tape and Reel; Min Operating Temperature: -40°C; RoHS Compliant: Yes; Frequency: 200MHz; Mount: Surface Mount; Max Operating Temperature: 85°C

## Sheet IF_Amp.SchDoc
size A3; SheetNumber: 8; SheetTotal: 8
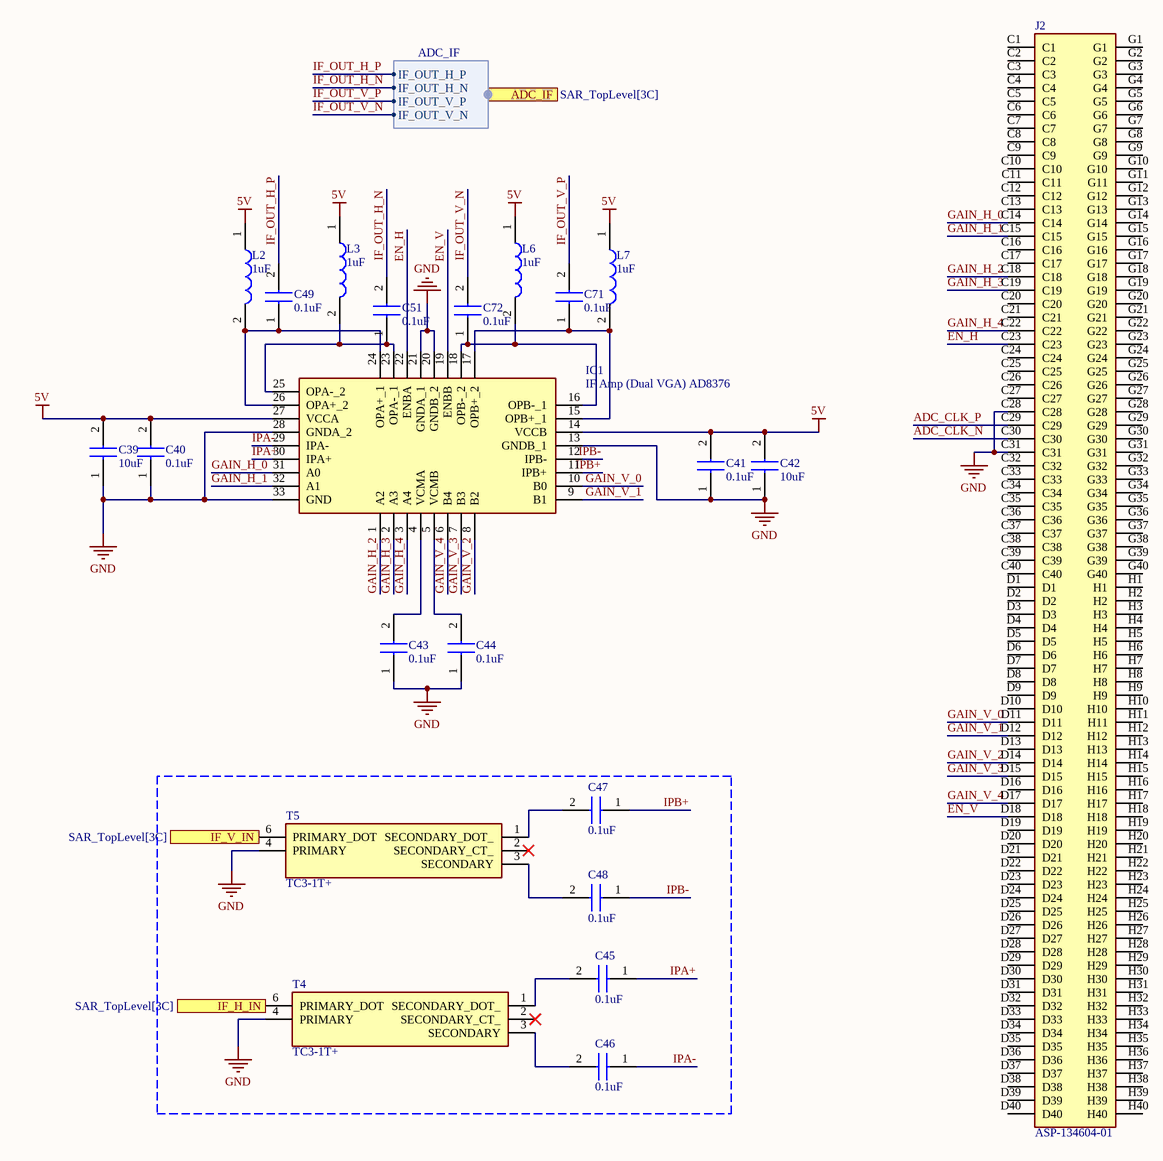
[diagram p4: IF_Amp.SchDoc]

### Parts
C39  10uF  [C1206_FT]
C40  0.1uF  [C0402C104J4RACTU]
C41  0.1uF  [C0402C104J4RACTU]
C42  10uF  [C1206_FT]
C43  0.1uF  [C0402C104J4RACTU]
C44  0.1uF  [C0402C104J4RACTU]
C45  0.1uF  [C0402C104J4RACTU]
C46  0.1uF  [C0402C104J4RACTU]
C47  0.1uF  [C0402C104J4RACTU]
C48  0.1uF  [C0402C104J4RACTU]
C49  0.1uF  [C0402C104J4RACTU]
C51  0.1uF  [C0402C104J4RACTU]
C71  0.1uF  [C0402C104J4RACTU]
C72  0.1uF  [C0402C104J4RACTU]
IC1  IF Amp (Dual VGA) AD8376  [QFN50P500X500X80-33N-D]
J2  ASP-134604-01  [ASP13460401]
L2  1uF  [7447610310]
L3  1uF  [7447610310]
L6  1uF  [7447610310]
L7  1uF  [7447610310]
T4  TC3-1T+  [TC31T]
T5  TC3-1T+  [TC31T]

### Ports
ADC_IF (harness ADC_IF, see SAR_TopLevel[3C]), IF_H_IN (in, see SAR_TopLevel[3C]), IF_V_IN (in, see SAR_TopLevel[3C])

### Harnesses
ADC_IF: IF_OUT_V_N, IF_OUT_H_N, IF_OUT_H_P, IF_OUT_V_P

### Nets
5V: C39.2 C40.2 C41.2 C42.2 IC1.14(VCCB) IC1.27(VCCA) L2.1 L3.1 L6.1 L7.1
GND: C39.1 C40.1 C41.1 C42.1 C43.1 C44.1 IC1.13(GNDB_1) IC1.20(GNDB_2) IC1.21(GNDA_1) IC1.28(GNDA_2) IC1.33(GND) J2.C28 J2.C31 T4.4(PRIMARY) T5.4(PRIMARY)
ADC_CLK_N: J2.C30
ADC_CLK_P: J2.C29
EN_H: IC1.22(ENBA) J2.C23
EN_V: IC1.19(ENBB) J2.D18
GAIN_H_0: IC1.31(A0) J2.C14
GAIN_H_1: IC1.32(A1) J2.C15
GAIN_H_2: IC1.1(A2) J2.C18
GAIN_H_3: IC1.2(A3) J2.C19
GAIN_H_4: IC1.3(A4) J2.C22
GAIN_V_0: IC1.10(B0) J2.D11
GAIN_V_1: IC1.9(B1) J2.D12
GAIN_V_2: IC1.8(B2) J2.D14
GAIN_V_3: IC1.7(B3) J2.D15
GAIN_V_4: IC1.6(B4) J2.D17
IF_OUT_H_N: C51.2 ; port ADC_IF.IF_OUT_H_N
IF_OUT_H_P: C49.2 ; port ADC_IF.IF_OUT_H_P
IF_OUT_V_N: C72.2 ; port ADC_IF.IF_OUT_V_N
IF_OUT_V_P: C71.2 ; port ADC_IF.IF_OUT_V_P
IPA+: C45.1 IC1.30(IPA+)
IPA-: C46.1 IC1.29(IPA-)
IPB+: C47.1 IC1.11(IPB+)
IPB-: C48.1 IC1.12(IPB-)
NetC43_2: C43.2 IC1.4(VCMA)
NetC44_2: C44.2 IC1.5(VCMB)
NetC45_2: C45.2 T4.1(SECONDARY_DOT_)
NetC46_2: C46.2 T4.3(SECONDARY)
NetC47_2: C47.2 T5.1(SECONDARY_DOT_)
NetC48_2: C48.2 T5.3(SECONDARY)
NetC49_1: C49.1 IC1.24(OPA+_1) IC1.26(OPA+_2) L2.2
NetC51_1: C51.1 IC1.23(OPA-_1) IC1.25(OPA-_2) L3.2
NetC71_1: C71.1 IC1.15(OPB+_1) IC1.17(OPB+_2) L7.2
NetC72_1: C72.1 IC1.16(OPB-_1) IC1.18(OPB-_2) L6.2
NetT4_6: T4.6(PRIMARY_DOT) ; port IF_H_IN
NetT5_6: T5.6(PRIMARY_DOT) ; port IF_V_IN

Not connected (* = marked no-connect by the designer): J2 C1 C2 C3 C4 C5 C6 C7 C8 C9 C10 C11 C12 C13 C16 C17 C20 C21 C24 C25 C26 C27 C32 C33 C34 C35 C36 C37 C38 C39 C40 D1 D2 D3 D4 D5 D6 D7 D8 D9 D10 D13 D16 D19 D20 D21 D22 D23 D24 D25 D26 D27 D28 D29 D30 D31 D32 D33 D34 D35 D36 D37 D38 D39 D40 G1 G2 G3 G4 G5 G6 G7 G8 G9 G10 G11 G12 G13 G14 G15 G16 G17 G18 G19 G20 G21 G22 G23 G24 G25 G26 G27 G28 G29 G30 G31 G32 G33 G34 G35 G36 G37 G38 G39 G40 H1 H2 H3 H4 H5 H6 H7 H8 H9 H10 H11 H12 H13 H14 H15 H16 H17 H18 H19 H20 H21 H22 H23 H24 H25 H26 H27 H28 H29 H30 H31 H32 H33 H34 H35 H36 H37 H38 H39 H40; T4 2(SECONDARY_CT_)*; T5 2(SECONDARY_CT_)*

### Library data of the parts
C39 C42 = 1206 10uF Capacitor: C1206X106M3RACAUTO; Manufacturer_Name: Yageo Group; Datasheet Link: https://www.yageogroup.com/content/datasheet/asset/file/KEM_C1078_X7R_FT-CAP_AUTO_SMD; Manufacturer_Part_Number: C1206X106M3RACAUTO; Mouser Part Number: 80-C1206X106M3RAUTO; Mouser Price/Stock: https://www.mouser.co.uk/ProductDetail/KEMET/C1206X106M3RACAUTO?qs=HXFqYaX1Q2xSroSoadzbnw%3D%3D; Arrow Part Number: C1206X106M3RACAUTO; Arrow Price/Stock: https://www.arrow.com/en/products/c1206x106m3racauto/kemet-corporation?utm_currency=USD&region=nac
C40 C41 C43-C49 C51 C71 C72 = 0402 0.1uF Capacitor: C0402C104K4RACTU; Manufacturer_Name: Yageo Group; Datasheet Link: https://content.kemet.com/datasheets/KEM_C1002_X7R_SMD.pdf; Height: 0.55mm; Manufacturer_Part_Number: C0402C104K4RACTU; Mouser Part Number: 80-C0402C104K4R; Mouser Price/Stock: https://www.mouser.co.uk/ProductDetail/KEMET/C0402C104K4RACTU?qs=DBJr%252BvBUjU54jK7d4uAeew%3D%3D; Arrow Part Number: C0402C104K4RACTU; Arrow Price/Stock: https://www.arrow.com/en/products/c0402c104k4ractu/kemet-corporation.html?utm_currency=USD&region=nac
IC1 = IF Amp (Dual VGA) AD8376: AD8376ACPZ-R7; Manufacturer_Name: Analog Devices; Datasheet Link: https://www.analog.com/media/en/technical-documentation/data-sheets/ad8376.pdf; Height: 0.8mm; Manufacturer_Part_Number: AD8376ACPZ-R7; Mouser Part Number: 584-AD8376ACPZ-R7; Mouser Price/Stock: https://www.mouser.co.uk/ProductDetail/Analog-Devices/AD8376ACPZ-R7?qs=%2FtpEQrCGXCx%252BVfPSiG%2FcvQ%3D%3D; Arrow Part Number: AD8376ACPZ-R7; Arrow Price/Stock: https://www.arrow.com/en/products/ad8376acpz-r7/analog-devices?region=nac
J2 = ASP-134604-01: Connector; Manufacturer_Name: SAMTEC; Datasheet Link: https://componentsearchengine.com/Datasheets/2/ASP-134604-01.pdf; Height: 7.11mm; Manufacturer_Part_Number: ASP-134604-01; Mouser Part Number: 200-ASP-134604-01; Mouser Price/Stock: https://www.mouser.co.uk/ProductDetail/Samtec/ASP-134604-01?qs=Rp%2FUEJiACm00i8g2mQ6XNw%3D%3D; Arrow Part Number: ASP-134604-01; Arrow Price/Stock: https://www.arrow.com/en/products/asp-134604-01/samtec.html?utm_currency=USD&region=nac
L2 L3 L6 L7 = 0603 1uH Inductor: 7447610310; Manufacturer_Name: Wurth Elektronik; Datasheet Link: https://www.we-online.com/catalog/datasheet/7447610310.pdf; Height: 0.9mm; Manufacturer_Part_Number: 7447610310
T4 T5 = TC3-1T+: Transformer; Manufacturer_Name: Mini-Circuits; Datasheet Link: https://datasheet.datasheetarchive.com/originals/distributors/Datasheets-28/DSA-546328.pdf; Height: 4mm; Manufacturer_Part_Number: TC3-1T+; Mouser Part Number: 139-TC3-1T; Mouser Price/Stock: https://www.mouser.co.uk/ProductDetail/Mini-Circuits/TC3-1T%2b?qs=xZ%2FP%252Ba9zWqZHx%2FHxCJInOw%3D%3D

## Sheet Power.SchDoc
size A; SheetNumber: 5; SheetTotal: 8
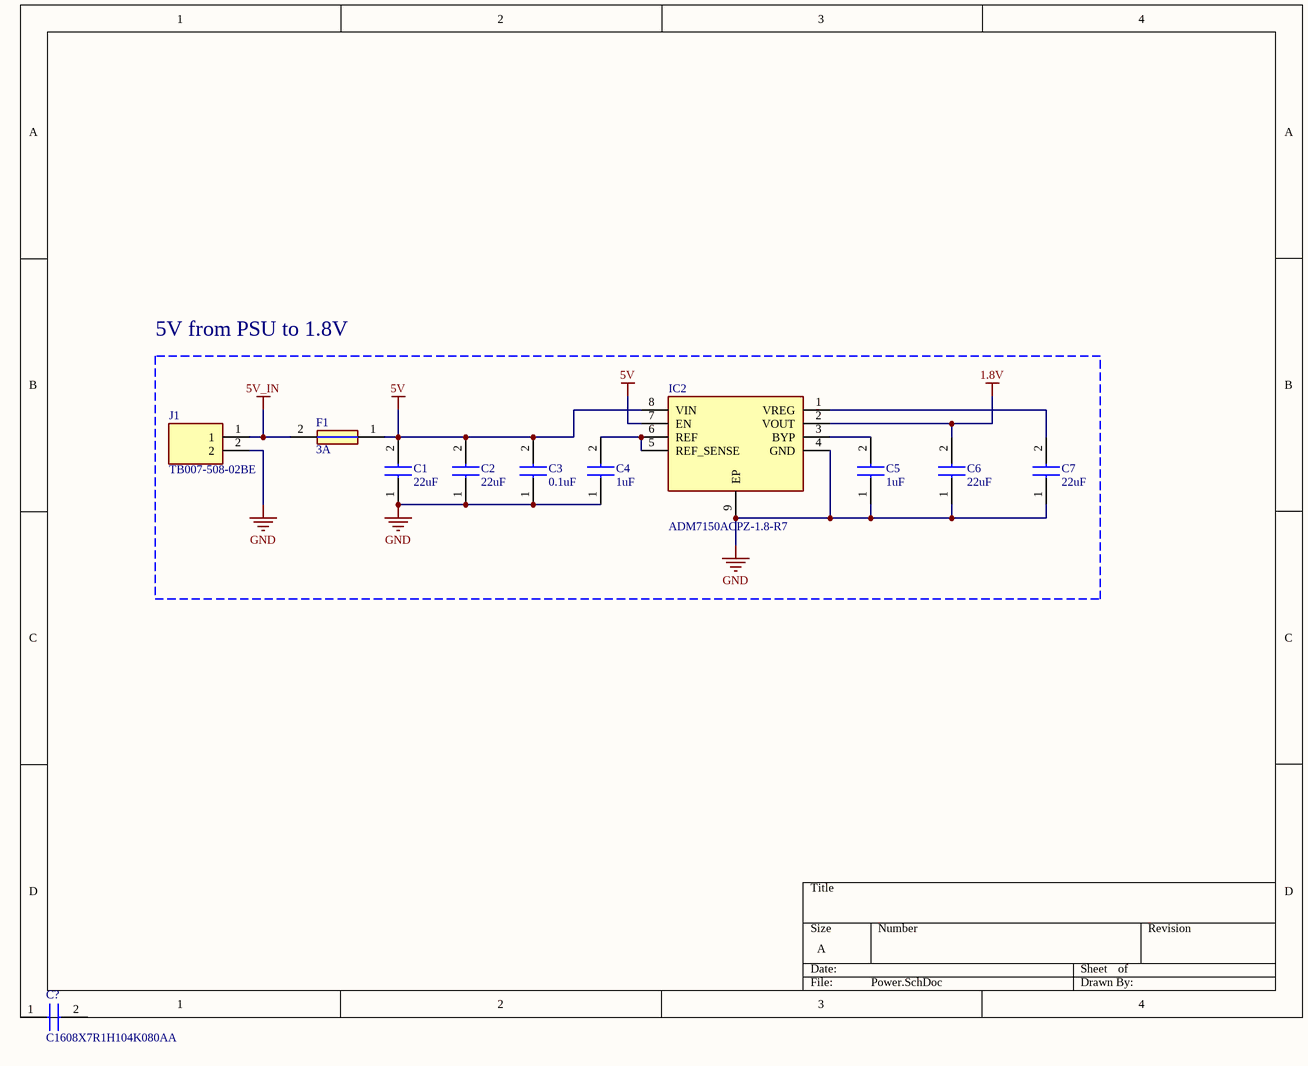
[diagram p5: Power.SchDoc]

### Parts
(Parts that share a designator on the sheet are numbered #1, #2 ... from top to bottom, then left to right.)
C1#2  22uF  [CAPC3225X230N]
C2#2  22uF  [CAPC3225X230N]
C3#2  0.1uF  [CAPC1608X80N]
C4#2  1uF  [CAPC1608X80N]
C5#2  1uF  [CAPC1608X80N]
C6#2  22uF  [CAPC3225X230N]
C7#2  22uF  [CAPC3225X230N]
C?  C1608X7R1H104K080AA  [CAPC1608X80N]
F1  3A  [FUSC3216X98N]
IC2  ADM7150ACPZ-1.8-R7  [SON50P300X300X85-9N-D]
J1  TB007-508-02BE  [TB007-508-02BE]

### Blocks framed on the sheet
5V from PSU to 1.8V: C1#2 C2#2 C3#2 C4#2 C5#2 C6#2 C7#2 F1 IC2 J1

### Nets
1.8V: C6#2.2 IC2.2(VOUT)
5V: C1#2.2 C2#2.2 C3#2.2 F1.1 IC2.7(EN) IC2.8(VIN)
5V_IN: F1.2 J1.1
GND: C1#2.1 C2#2.1 C3#2.1 C4#2.1 C5#2.1 C6#2.1 C7#2.1 IC2.4(GND) IC2.9(EP) J1.2
NetC4#2_2: C4#2.2 IC2.5(REF_SENSE) IC2.6(REF)
NetC5#2_2: C5#2.2 IC2.3(BYP)
NetC7#2_2: C7#2.2 IC2.1(VREG)

Not connected (* = marked no-connect by the designer): C? 1 2

### Library data of the parts
C1#2 C2#2 C6#2 C7#2 = 1210 22uF Capacitor: C3225X7R1E226M250AB; Manufacturer_Name: TDK; Datasheet Link: https://product.tdk.com/info/en/catalog/datasheets/mlcc_commercial_midvoltage_en.pdf; Height: 2.3mm; Manufacturer_Part_Number: C3225X7R1E226M250AB; Mouser Part Number: 810-C3225X7R1EM250AB; Mouser Price/Stock: https://www.mouser.co.uk/ProductDetail/TDK/C3225X7R1E226M250AB?qs=gZXFycFWdAOxso2lxwRfpg%3D%3D; Arrow Part Number: C3225X7R1E226M250AB; Arrow Price/Stock: https://www.arrow.com/en/products/c3225x7r1e226m250ab/tdk?region=nac
C3#2 = 0603 0.1uF Capacitor: C1608X7R1H104K080AA; Manufacturer_Name: TDK; Datasheet Link: https://product.tdk.com/info/en/catalog/datasheets/mlcc_commercial_midvoltage_en.pdf; Height: 0.8mm; Manufacturer_Part_Number: C1608X7R1H104K080AA; Mouser Part Number: 810-C1608X7R1H104K; Mouser Price/Stock: https://www.mouser.co.uk/ProductDetail/TDK/C1608X7R1H104K080AA?qs=NRhsANhppD8dEJli2CDBHA%3D%3D; Arrow Part Number: C1608X7R1H104K080AA; Arrow Price/Stock: https://www.arrow.com/en/products/c1608x7r1h104k080aa/tdk.html?utm_currency=USD&region=asia
C4#2 C5#2 = 0603 1uF Capacitor: C1608X7R1C105K080AC; Manufacturer_Name: TDK; Datasheet Link: https://product.tdk.com/info/en/catalog/datasheets/mlcc_commercial_midvoltage_en.pdf; Height: 0.8mm; Manufacturer_Part_Number: C1608X7R1C105K080AC; Mouser Part Number: 810-C1608X7R1C105K; Mouser Price/Stock: https://www.mouser.co.uk/ProductDetail/TDK/C1608X7R1C105K080AC?qs=NRhsANhppD%2FMM4SE1SUXmg%3D%3D; Arrow Part Number: C1608X7R1C105K080AC; Arrow Price/Stock: https://www.arrow.com/en/products/c1608x7r1c105k080ac/tdk?utm_currency=USD&region=nac
C? = C1608X7R1H104K080AA: Capacitor; Manufacturer_Name: TDK; Datasheet Link: https://product.tdk.com/info/en/catalog/datasheets/mlcc_commercial_midvoltage_en.pdf; Height: 0.8mm; Manufacturer_Part_Number: C1608X7R1H104K080AA; Mouser Part Number: 810-C1608X7R1H104K; Mouser Price/Stock: https://www.mouser.co.uk/ProductDetail/TDK/C1608X7R1H104K080AA?qs=NRhsANhppD8dEJli2CDBHA%3D%3D; Arrow Part Number: C1608X7R1H104K080AA; Arrow Price/Stock: https://www.arrow.com/en/products/c1608x7r1h104k080aa/tdk.html?utm_currency=USD&region=asia
F1 = 0407003.WRA: 3A Slow-Blow Fuse, 32V; Manufacturer_Name: LITTELFUSE; Datasheet Link: https://cdn1-originals.webdamdb.com/12956_127233622?cache=1686747046&response-content-disposition=inline;filename=Littelfuse_Fuse_407A_Datasheet.pdf&response-content-type=application/pdf&Policy=eyJTdGF0ZW1lbnQiOlt7IlJlc291cmNlIjoiaHR0cCo6Ly9jZG4xLW9yaWdpb; Height: 0.985mm; Manufacturer_Part_Number: 0407003.WRA; Mouser Part Number: 576-0407003.WRA; Mouser Price/Stock: https://www.mouser.co.uk/ProductDetail/Littelfuse/0407003.WRA?qs=QNEnbhJQKvag6lfcn2%2FiyQ%3D%3D
IC2 = ADM7150ACPZ-1.8-R7: Integrated Circuit; Manufacturer_Name: Analog Devices; Datasheet Link: https://www.analog.com/media/en/technical-documentation/data-sheets/ADM7150.pdf; Height: 0.85mm; Manufacturer_Part_Number: ADM7150ACPZ-1.8-R7; Mouser Part Number: 584-ADM7150ACPZ1.8R7; Mouser Price/Stock: https://www.mouser.co.uk/ProductDetail/Analog-Devices/ADM7150ACPZ-1.8-R7?qs=y2kkmE52mdMoOvxUkkHOHg%3D%3D; Arrow Part Number: ADM7150ACPZ-1.8-R7; Arrow Price/Stock: https://www.arrow.com/en/products/adm7150acpz-1.8-r7/analog-devices.html?utm_currency=USD&region=nac
J1 = TB007-508-02BE: Connector; Manufacturer_Name: Same Sky; Datasheet Link: https://www.sameskydevices.com/product/resource/supplyframepdf/tb007-508.pdf; Height: 14mm; Manufacturer_Part_Number: TB007-508-02BE; Mouser Part Number: 490-TB007-508-02BE; Mouser Price/Stock: https://www.mouser.co.uk/ProductDetail/Same-Sky/TB007-508-02BE?qs=vLWxofP3U2y6PFKAfCqKUQ%3D%3D; Arrow Part Number: TB007-508-02BE; Arrow Price/Stock: https://www.arrow.com/en/products/tb007-508-02be/cui-devices.html?utm_currency=USD&region=asia

## Sheet ADC.SchDoc
size A3; SheetNumber: 2; SheetTotal: 8
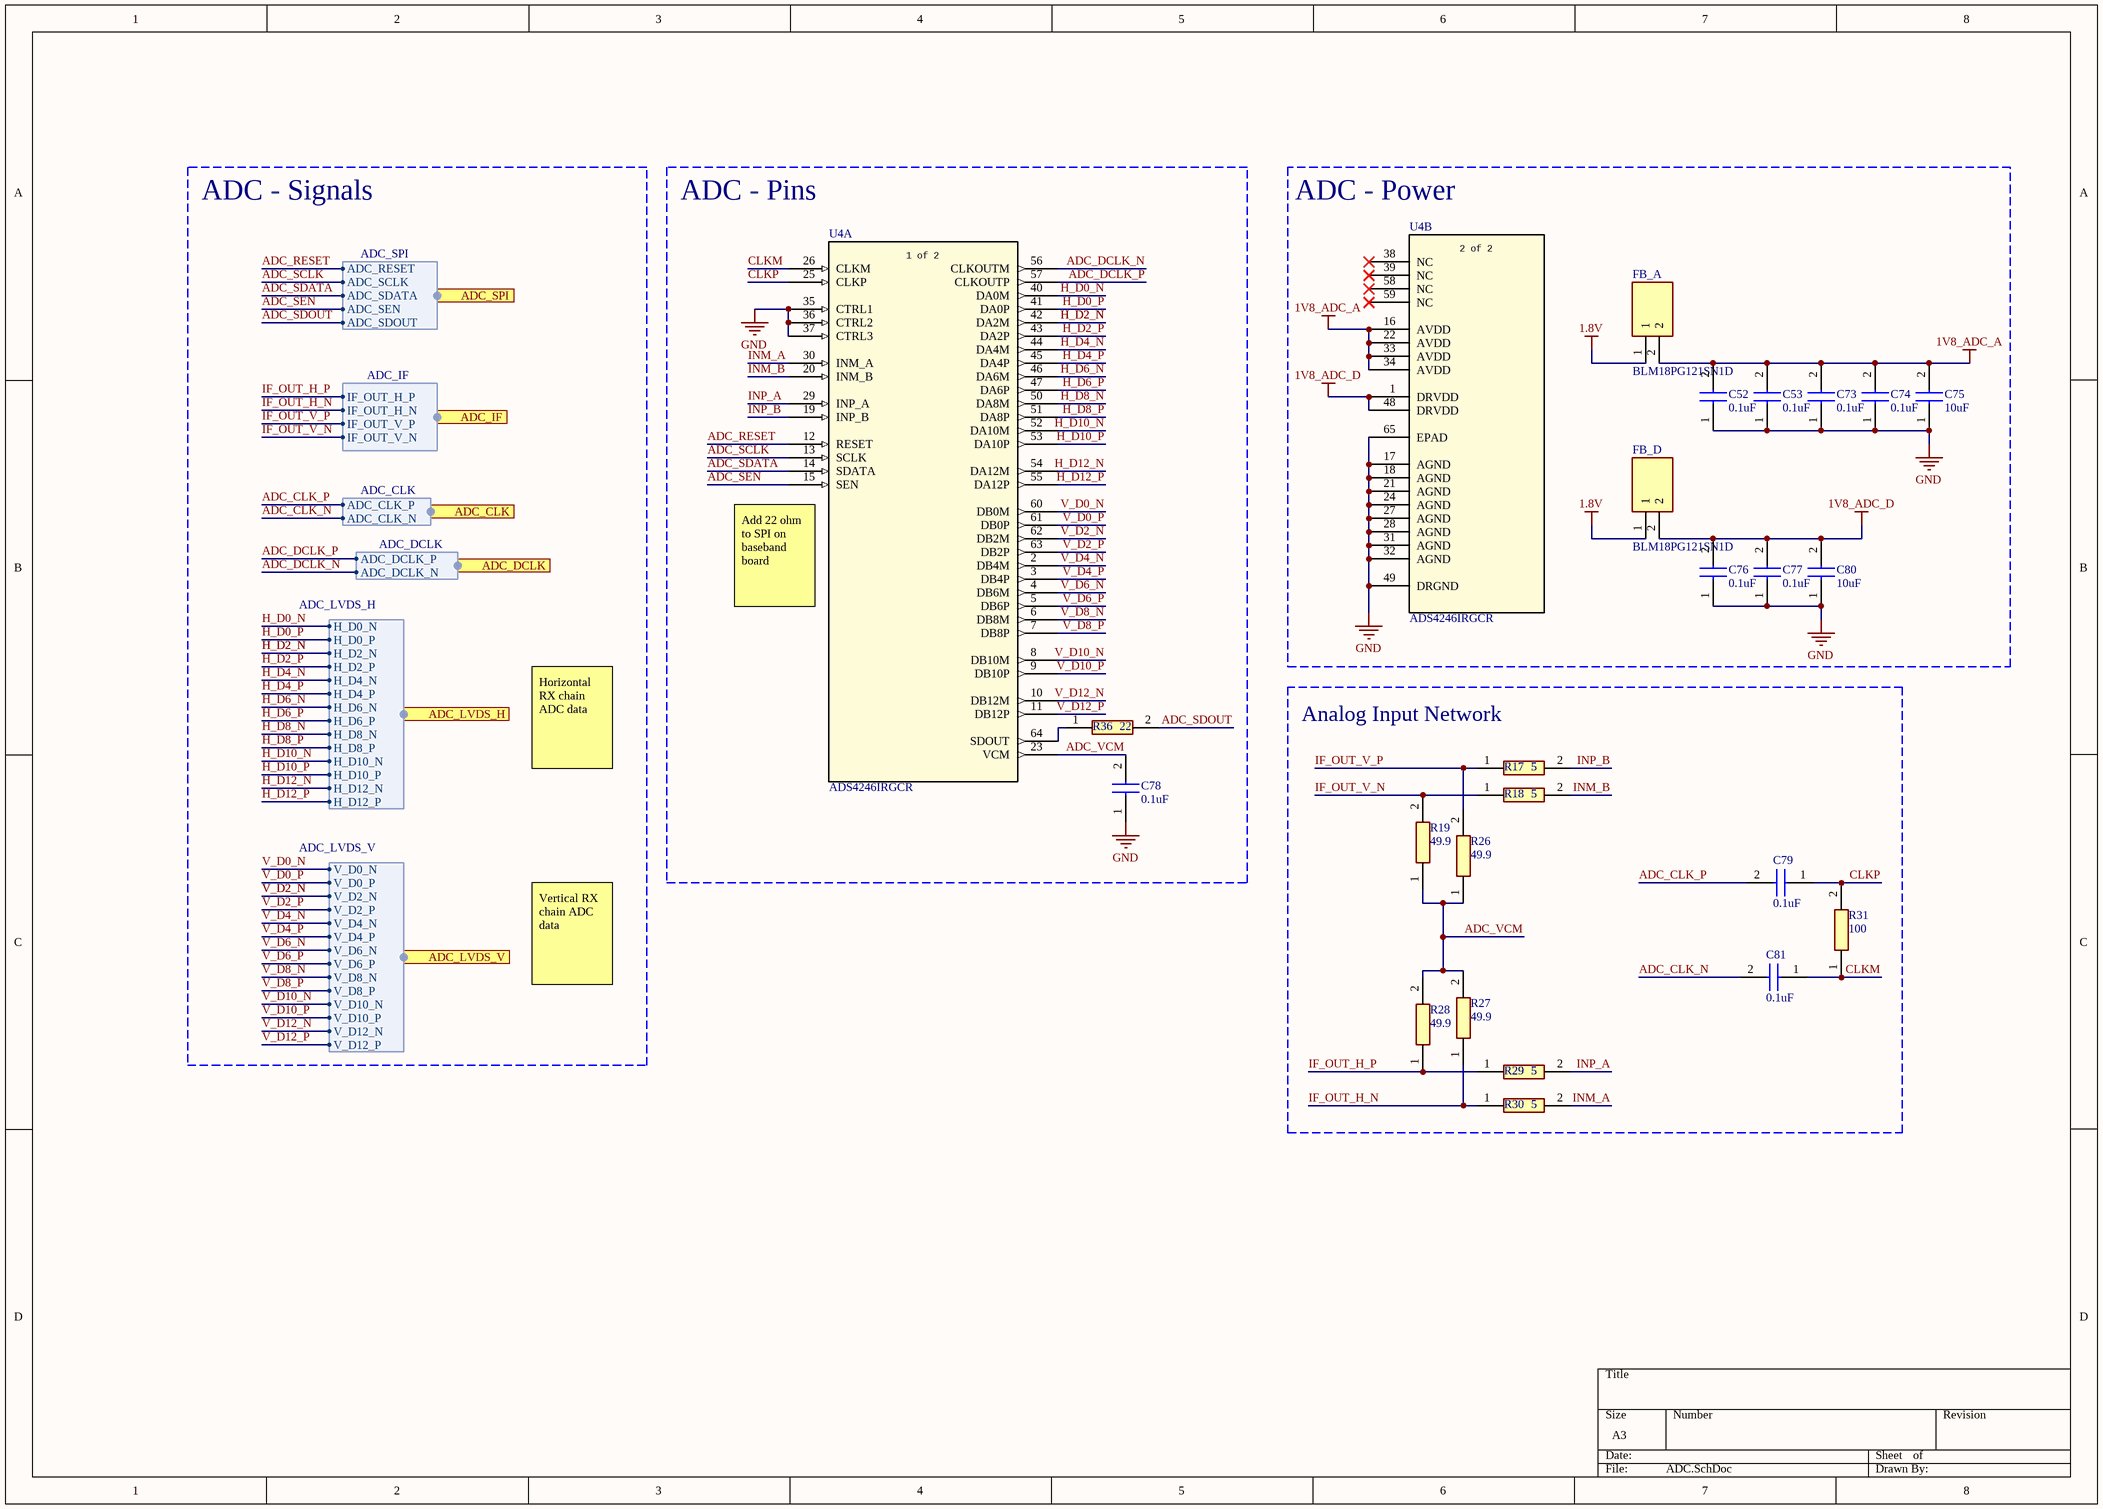
[diagram p6: ADC.SchDoc]

### Parts
C52  0.1uF  [C0402C104J4RACTU]
C53  0.1uF  [C0402C104J4RACTU]
C73  0.1uF  [C0402C104J4RACTU]
C74  0.1uF  [C0402C104J4RACTU]
C75  10uF  [C1206_FT]
C76  0.1uF  [C0402C104J4RACTU]
C77  0.1uF  [C0402C104J4RACTU]
C78  0.1uF  [C0402C104J4RACTU]
C79  0.1uF  [C0402C104J4RACTU]
C80  10uF  [C1206_FT]
C81  0.1uF  [C0402C104J4RACTU]
FB_A  BLM18PG121SN1D  [BLM18SP221SN1B]
FB_D  BLM18PG121SN1D  [BLM18SP221SN1B]
R17  5  [RESC1005X40N]
R18  5  [RESC1005X40N]
R19  49.9  [RESC1005X40N]
R26  49.9  [RESC1005X40N]
R27  49.9  [RESC1005X40N]
R28  49.9  [RESC1005X40N]
R29  5  [RESC1005X40N]
R30  5  [RESC1005X40N]
R31  100  [RESC1005X37N]
R36  22  [RESC1005X40N]
U4  ADS4246IRGCR  [RGC64_7P4X7P4]  (parts A,B of 2)

### Blocks framed on the sheet
ADC - Pins: C78 R36 U4
ADC - Power: C52 C53 C73-C77 C80 FB_A FB_D U4
Analog Input Network: C79 C81 R17-R19 R26-R31

### Ports
ADC_CLK (harness ADC_CLK), ADC_DCLK (harness ADC_DCLK), ADC_IF (harness ADC_IF), ADC_LVDS_H (harness ADC_LVDS_H), ADC_LVDS_V (harness ADC_LVDS_V), ADC_SPI (harness ADC_SPI)

### Harnesses
ADC_IF: IF_OUT_V_N, IF_OUT_H_N, IF_OUT_H_P, IF_OUT_V_P
ADC_CLK: ADC_CLK_P, ADC_CLK_N
ADC_SPI: ADC_SCLK, ADC_SEN, ADC_SDOUT, ADC_SDATA, ADC_RESET
ADC_LVDS_H: H_D0_N, H_D12_P, H_D12_N, H_D10_P, H_D10_N, H_D8_P, H_D8_N, H_D6_P, H_D6_N, H_D4_N, H_D2_P, H_D2_N, H_D0_P, H_D4_P
ADC_LVDS_V: V_D0_N, V_D12_P, V_D12_N, V_D10_P, V_D10_N, V_D8_P, V_D8_N, V_D6_P, V_D6_N, V_D4_N, V_D2_P, V_D0_P, V_D4_P, V_D2_N
ADC_DCLK: ADC_DCLK_N, ADC_DCLK_P

### Nets
1.8V: FB_A.1 FB_D.1
1V8_ADC_A: C52.2 C53.2 C73.2 C74.2 C75.2 FB_A.2 U4.16(AVDD) U4.22(AVDD) U4.33(AVDD) U4.34(AVDD)
1V8_ADC_D: C76.2 C77.2 C80.2 FB_D.2 U4.1(DRVDD) U4.48(DRVDD)
GND: C52.1 C53.1 C73.1 C74.1 C75.1 C76.1 C77.1 C78.1 C80.1 U4.17(AGND) U4.18(AGND) U4.21(AGND) U4.24(AGND) U4.27(AGND) U4.28(AGND) U4.31(AGND) U4.32(AGND) U4.35(CTRL1) U4.36(CTRL2) U4.37(CTRL3) U4.49(DRGND) U4.65(EPAD)
ADC_CLK_N: C81.2 ; port ADC_CLK.ADC_CLK_N
ADC_CLK_P: C79.2 ; port ADC_CLK.ADC_CLK_P
ADC_DCLK_N: U4.56(CLKOUTM) ; port ADC_DCLK.ADC_DCLK_N
ADC_DCLK_P: U4.57(CLKOUTP) ; port ADC_DCLK.ADC_DCLK_P
ADC_RESET: U4.12(RESET) ; port ADC_SPI.ADC_RESET
ADC_SCLK: U4.13(SCLK) ; port ADC_SPI.ADC_SCLK
ADC_SDATA: U4.14(SDATA) ; port ADC_SPI.ADC_SDATA
ADC_SDOUT: R36.2 ; port ADC_SPI.ADC_SDOUT
ADC_SEN: U4.15(SEN) ; port ADC_SPI.ADC_SEN
ADC_VCM: C78.2 R19.1 R26.1 R27.2 R28.2 U4.23(VCM)
CLKM: C81.1 R31.1 U4.26(CLKM)
CLKP: C79.1 R31.2 U4.25(CLKP)
H_D0_N: U4.40(DA0M) ; port ADC_LVDS_H.H_D0_N
H_D0_P: U4.41(DA0P) ; port ADC_LVDS_H.H_D0_P
H_D2_N: U4.42(DA2M) ; port ADC_LVDS_H.H_D2_N
H_D2_P: U4.43(DA2P) ; port ADC_LVDS_H.H_D2_P
H_D4_N: U4.44(DA4M) ; port ADC_LVDS_H.H_D4_N
H_D4_P: U4.45(DA4P) ; port ADC_LVDS_H.H_D4_P
H_D6_N: U4.46(DA6M) ; port ADC_LVDS_H.H_D6_N
H_D6_P: U4.47(DA6P) ; port ADC_LVDS_H.H_D6_P
H_D8_N: U4.50(DA8M) ; port ADC_LVDS_H.H_D8_N
H_D8_P: U4.51(DA8P) ; port ADC_LVDS_H.H_D8_P
H_D10_N: U4.52(DA10M) ; port ADC_LVDS_H.H_D10_N
H_D10_P: U4.53(DA10P) ; port ADC_LVDS_H.H_D10_P
H_D12_N: U4.54(DA12M) ; port ADC_LVDS_H.H_D12_N
H_D12_P: U4.55(DA12P) ; port ADC_LVDS_H.H_D12_P
IF_OUT_H_N: R27.1 R30.1 ; port ADC_IF.IF_OUT_H_N
IF_OUT_H_P: R28.1 R29.1 ; port ADC_IF.IF_OUT_H_P
IF_OUT_V_N: R18.1 R19.2 ; port ADC_IF.IF_OUT_V_N
IF_OUT_V_P: R17.1 R26.2 ; port ADC_IF.IF_OUT_V_P
INM_A: R30.2 U4.30(INM_A)
INM_B: R18.2 U4.20(INM_B)
INP_A: R29.2 U4.29(INP_A)
INP_B: R17.2 U4.19(INP_B)
V_D0_N: U4.60(DB0M) ; port ADC_LVDS_V.V_D0_N
V_D0_P: U4.61(DB0P) ; port ADC_LVDS_V.V_D0_P
V_D2_N: U4.62(DB2M) ; port ADC_LVDS_V.V_D2_N
V_D2_P: U4.63(DB2P) ; port ADC_LVDS_V.V_D2_P
V_D4_N: U4.2(DB4M) ; port ADC_LVDS_V.V_D4_N
V_D4_P: U4.3(DB4P) ; port ADC_LVDS_V.V_D4_P
V_D6_N: U4.4(DB6M) ; port ADC_LVDS_V.V_D6_N
V_D6_P: U4.5(DB6P) ; port ADC_LVDS_V.V_D6_P
V_D8_N: U4.6(DB8M) ; port ADC_LVDS_V.V_D8_N
V_D8_P: U4.7(DB8P) ; port ADC_LVDS_V.V_D8_P
V_D10_N: U4.8(DB10M) ; port ADC_LVDS_V.V_D10_N
V_D10_P: U4.9(DB10P) ; port ADC_LVDS_V.V_D10_P
V_D12_N: U4.10(DB12M) ; port ADC_LVDS_V.V_D12_N
V_D12_P: U4.11(DB12P) ; port ADC_LVDS_V.V_D12_P
NetR36_1: R36.1 U4.64(SDOUT)

Not connected (* = marked no-connect by the designer): U4 38(NC)* 39(NC)* 58(NC)* 59(NC)*

### Notes on the sheet
- ADC - Signals
- (near U4) Add 22 ohm to SPI on baseband board
- Horizontal RX chain ADC data
- Vertical RX chain ADC data
- (in symbol ADS4246IRGCR, part A) 1 of 2
- (in symbol ADS4246IRGCR, part B) 2 of 2

### Library data of the parts
C52 C53 C73 C74 C76-C79 C81 = 0402 0.1uF Capacitor: as C40 on sheet IF_Amp; Datasheet Link: https://content.kemet.com/datasheets/KEM_C1002_X7R_SMD.pdf; Height: 0.55mm; Manufacturer_Part_Number: C0402C104K4RACTU; Mouser Part Number: 80-C0402C104K4R; Mouser Price/Stock: https://www.mouser.co.uk/ProductDetail/KEMET/C0402C104K4RACTU?qs=DBJr%252BvBUjU54jK7d4uAeew%3D%3D; Arrow Part Number: C0402C104K4RACTU; Arrow Price/Stock: https://www.arrow.com/en/products/c0402c104k4ractu/kemet-corporation.html?utm_currency=USD&region=nac
C75 C80 = 1206 10uF Capacitor: as C39 on sheet IF_Amp; Datasheet Link: https://www.yageogroup.com/content/datasheet/asset/file/KEM_C1078_X7R_FT-CAP_AUTO_SMD; Manufacturer_Part_Number: C1206X106M3RACAUTO; Mouser Part Number: 80-C1206X106M3RAUTO; Mouser Price/Stock: https://www.mouser.co.uk/ProductDetail/KEMET/C1206X106M3RACAUTO?qs=HXFqYaX1Q2xSroSoadzbnw%3D%3D; Arrow Part Number: C1206X106M3RACAUTO; Arrow Price/Stock: https://www.arrow.com/en/products/c1206x106m3racauto/kemet-corporation?utm_currency=USD&region=nac
FB_A FB_D = BLM18PG121SN1D: Ferrite Bead; Manufacturer_Name: Murata Electronics; Datasheet Link: http://www.murata.com/~/media/webrenewal/support/library/catalog/products/emc/emifil/c31e.ashx?la=en-gb; Height: 0.95mm; Manufacturer_Part_Number: BLM18PG121SN1D; Mouser Part Number: 81-BLM18PG121SN1D; Mouser Price/Stock: https://www.mouser.co.uk/ProductDetail/Murata-Electronics/BLM18PG121SN1D?qs=tY8e8KZalarVxhnmnUYZ1A%3D%3D; Arrow Part Number: BLM18PG121SN1D; Arrow Price/Stock: https://www.arrow.com/en/products/blm18pg121sn1d/murata-manufacturing.html?utm_currency=USD&region=europe
R17 R18 R29 R30 = 0402 5 Ohm Resistor: RC0402FR-075R1L; Manufacturer_Name: Yageo Group; Datasheet Link: https://yageogroup.com/component-documentation/download/specsheet/RC0402FR-075R1L?lang=en; Height: 0.4mm; Manufacturer_Part_Number: RC0402FR-075R1L; Mouser Part Number: 603-RC0402FR-075R1L; Mouser Price/Stock: https://www.mouser.co.uk/ProductDetail/YAGEO/RC0402FR-075R1L?qs=beCmh%2FXShNcKHNb5Mim9zw%3D%3D; Arrow Part Number: RC0402FR-075R1L; Arrow Price/Stock: https://www.arrow.com/en/products/rc0402fr-075r1l/yageo?region=nac
R19 R26-R28 = 0402 49.9 Ohm Resistor: RC0402FR-0749R9L; Manufacturer_Name: Yageo Group; Datasheet Link: https://www.yageo.com/upload/media/product/productsearch/datasheet/rchip/PYu-RC_Group_51_RoHS_L_12.pdf; Height: 0.4mm; Manufacturer_Part_Number: RC0402FR-0749R9L; Mouser Part Number: 603-RC0402FR-0749R9L; Mouser Price/Stock: https://www.mouser.co.uk/ProductDetail/YAGEO/RC0402FR-0749R9L?qs=lywS2nZzkrJ8zCaO%252B%252Bic5Q%3D%3D; Arrow Part Number: RC0402FR-0749R9L; Arrow Price/Stock: https://www.arrow.com/en/products/rc0402fr-0749r9l/yageo?region=nac
R31 = 0402 100 Ohm Resistor: AC0402FR-07100RL; Manufacturer_Name: Yageo Group; Datasheet Link: https://www.arrow.com/en/products/ac0402fr-07100rl/yageo?region=nac; Height: 0.37mm; Manufacturer_Part_Number: AC0402FR-07100RL; Mouser Part Number: 603-AC0402FR-07100RL; Mouser Price/Stock: https://www.mouser.co.uk/ProductDetail/YAGEO/AC0402FR-07100RL?qs=yhV1fb9g%2FKaIIQxJBW5mdg%3D%3D; Arrow Part Number: AC0402FR-07100RL; Arrow Price/Stock: https://www.arrow.com/en/products/ac0402fr-07100rl/yageo?region=nac
R36 = 0402 22 Ohm Resistor: RC0402FR-0722RL; Manufacturer_Name: Yageo Group; Datasheet Link: https://yageogroup.com/products/Resistors/part/RC0402FR-0722RL; Height: 0.4mm; Manufacturer_Part_Number: RC0402FR-0722RL; Mouser Part Number: 603-RC0402FR-0722RL; Mouser Price/Stock: https://www.mouser.co.uk/ProductDetail/YAGEO/RC0402FR-0722RL?qs=V1yeUXFNrkkRg6zf08ADKQ%3D%3D; Arrow Part Number: RC0402FR-0722RL; Arrow Price/Stock: https://www.arrow.com/en/products/rc0402fr-0722rl/yageo
U4 = ADS4246IRGCR: Dual-Channel, 14-Bit, 160-MSPS Analog-to-Digital Converter (ADC) 64-VQFN -40 to 85; Manufacturer_Name: Texas Instruments; Copyright: Copyright (C) 2026 Ultra Librarian. All rights reserved.; Manufacturer_Part_Number: ADS4246IRGCR; Datasheet: https://www.ti.com/lit/gpn/ads4246; RefDes: RefDes; Type: Type

## Sheet PA.SchDoc
size A; SheetNumber: 7; SheetTotal: 8
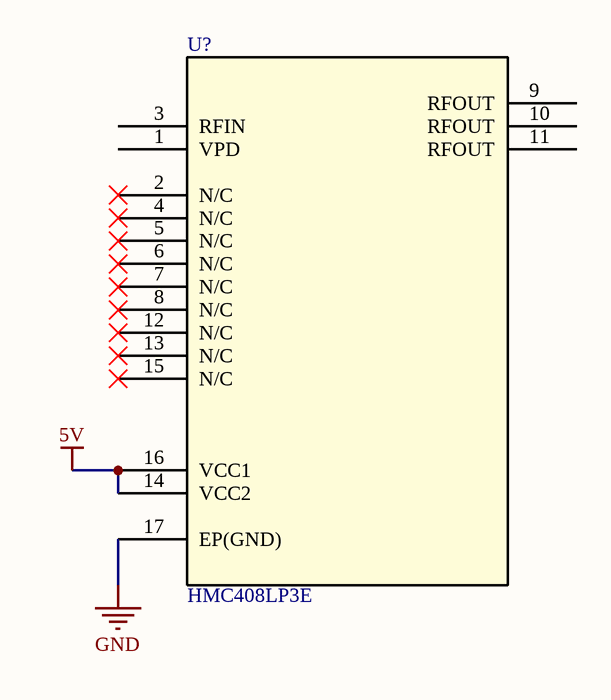
[diagram p7: PA.SchDoc]

### Parts
U?  HMC408LP3E  [HCP_16_1_ADI]

### Nets
5V: U?.14(VCC2) U?.16(VCC1)
GND: U?.17(EP(GND))

Not connected (* = marked no-connect by the designer): U? 1(VPD) 2(N/C)* 3(RFIN) 4(N/C)* 5(N/C)* 6(N/C)* 7(N/C)* 8(N/C)* 9(RFOUT) 10(RFOUT) 11(RFOUT) 12(N/C)* 13(N/C)* 15(N/C)*

### Library data of the parts
U? = HMC408LP3E_1: 1 Watt Power Amplifier SMT, 5.1 - 5.9 GHz; Manufacturer_Name: Analog Devices Inc; Copyright: Copyright (C) 2026 Ultra Librarian. All rights reserved.; Manufacturer_Part_Number: HMC408LP3E; Datasheet: https://www.analog.com/media/en/technical-documentation/data-sheets/hmc408.pdf; RefDes: RefDes; Type: Type

## Nets that join several sheets
1.8V: Power (C6#2.2 IC2.2), ADC (FB_A.1 FB_D.1)
5V: LNA_V (5 pins), MIXER_V (13 pins), IF_Amp (10 pins), Power (6 pins), MIXER_H (13 pins), LNA_H (5 pins), PA (U?.14 U?.16)
GND: LNA_V (9 pins), MIXER_V (26 pins), PLL (57 pins), IF_Amp (15 pins), Power (10 pins), MIXER_H (26 pins), LNA_H (9 pins), ADC (22 pins), PA (U?.17)